# EasyEDA Pro project ran-pang-airlink-86231b34.epro, schematic Schematic1_6, sheets 4 to 9 of 9

## Sheets
4 USB: Page Name: USB; Update Date: 2025-09-05
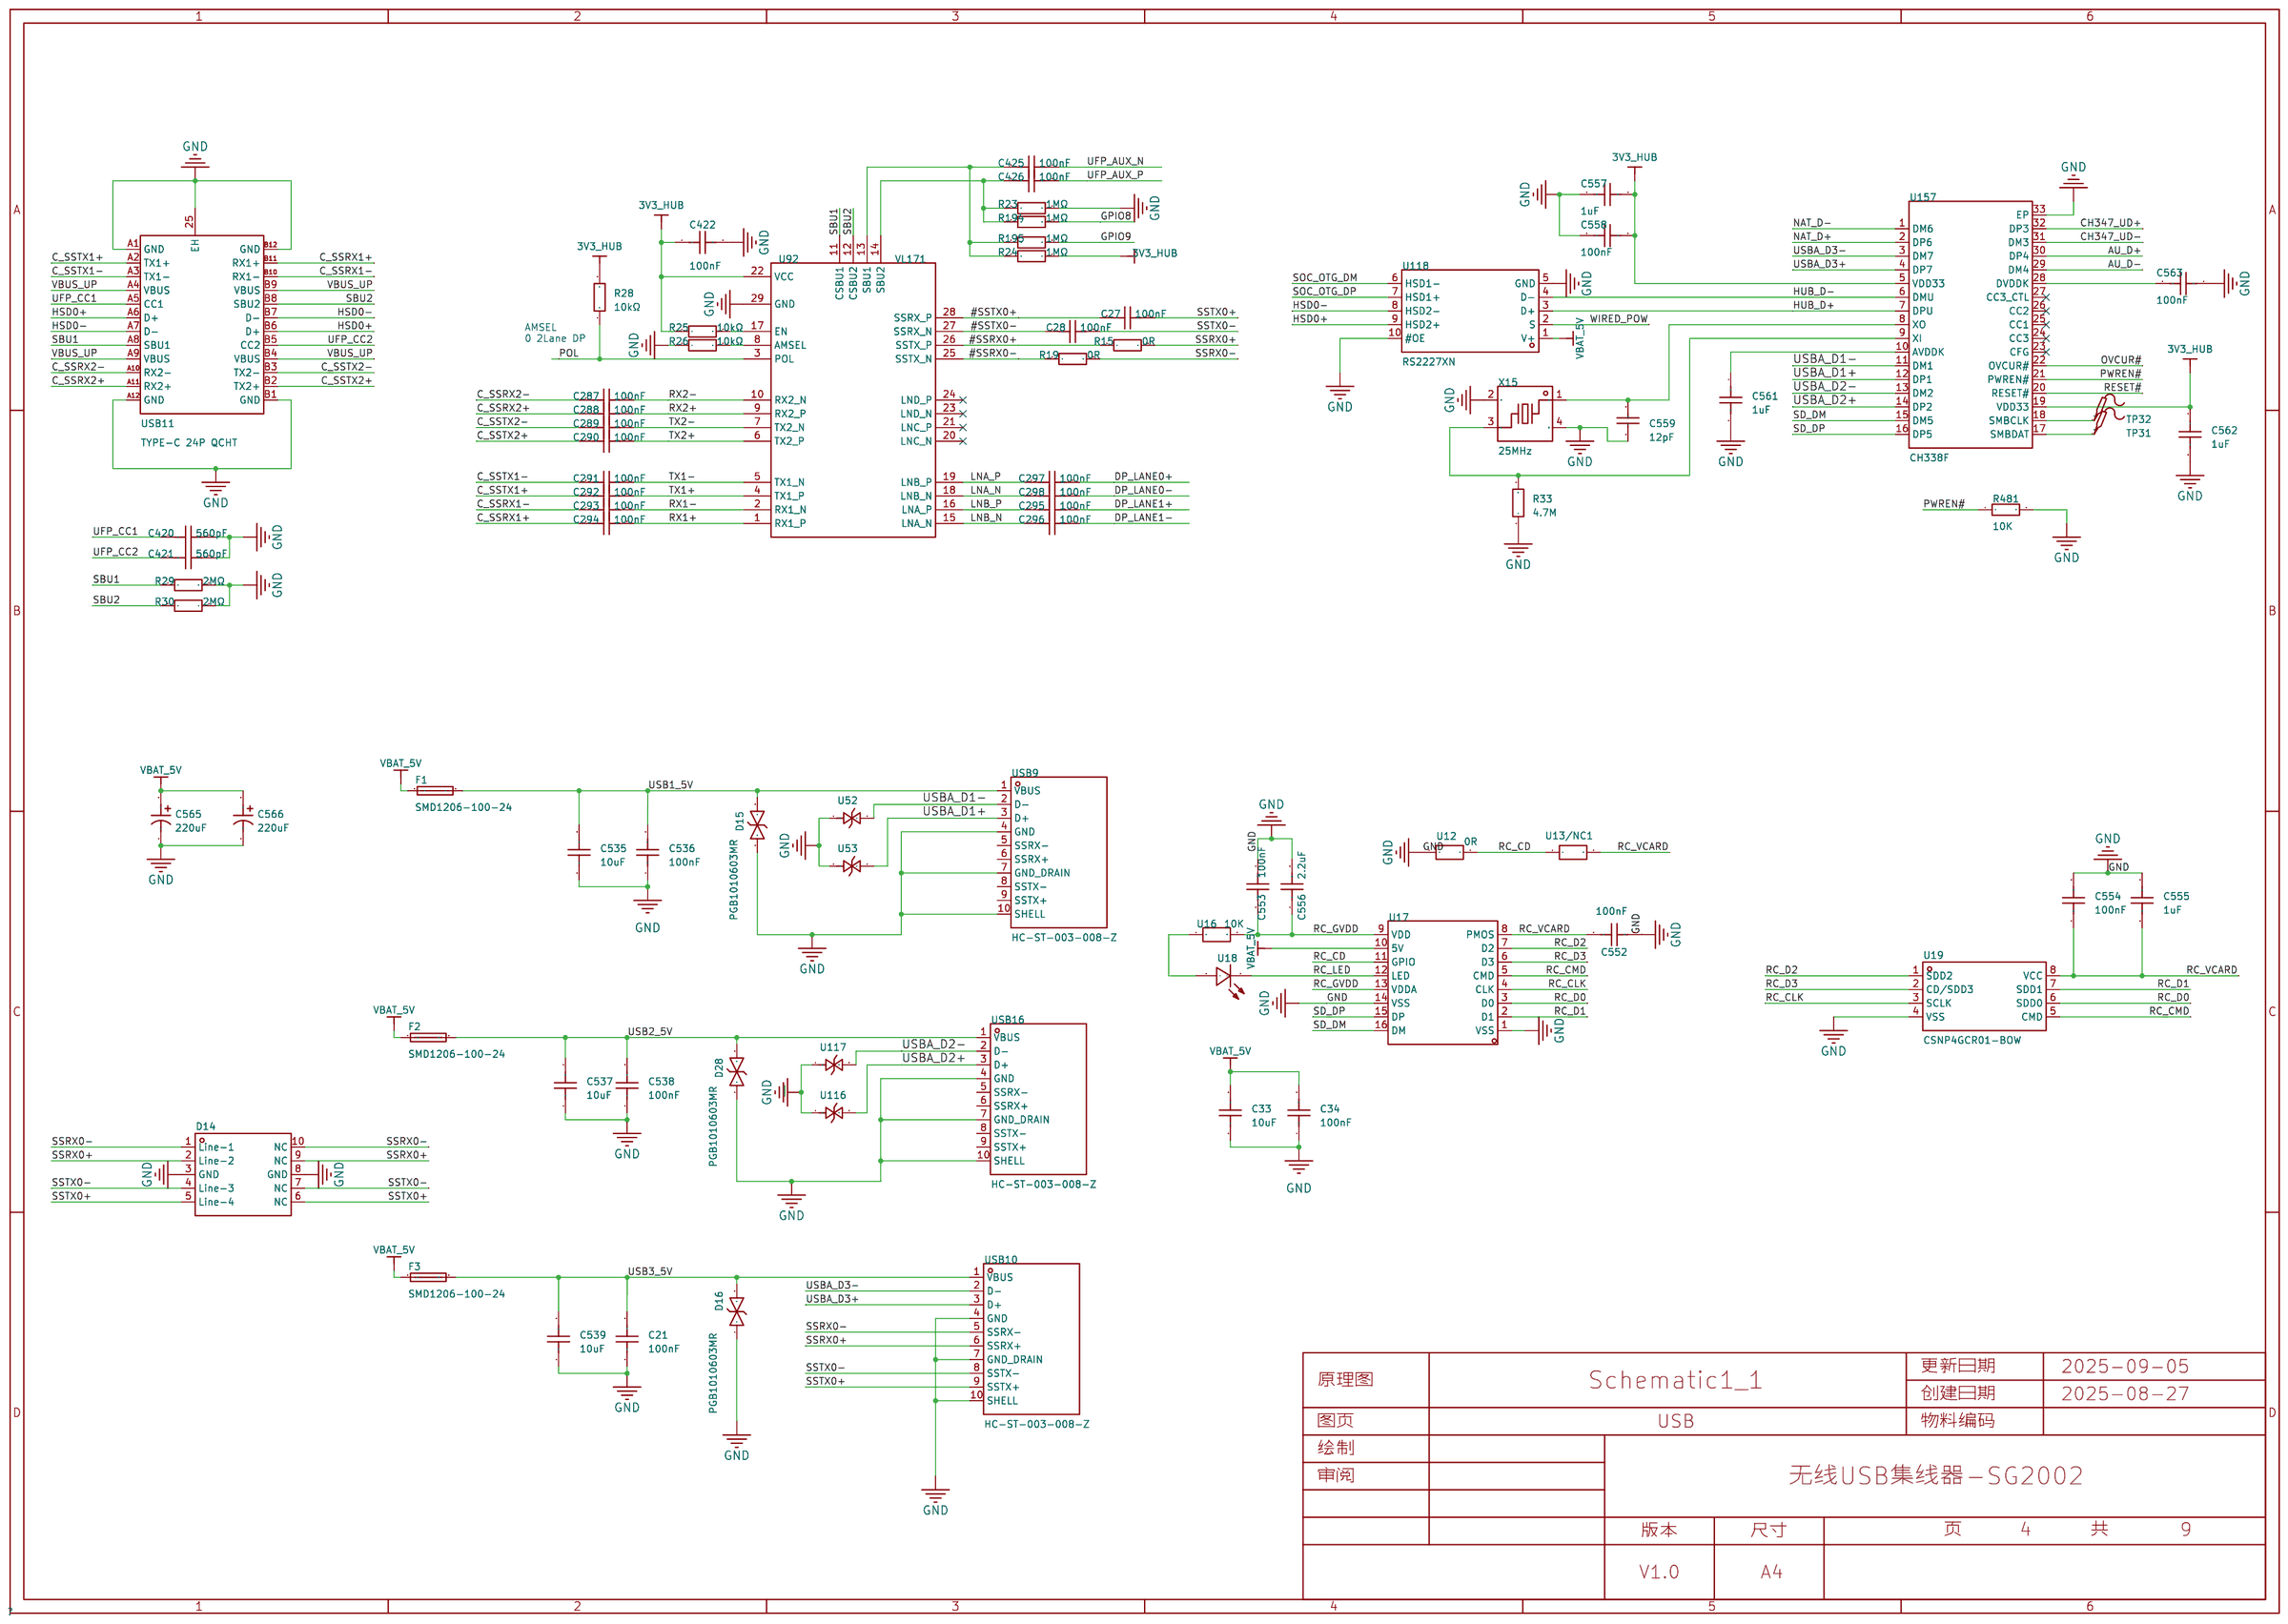
[diagram p3: USB]
5 USB-NAT: Page Name: USB-NAT; Update Date: 2025-08-28
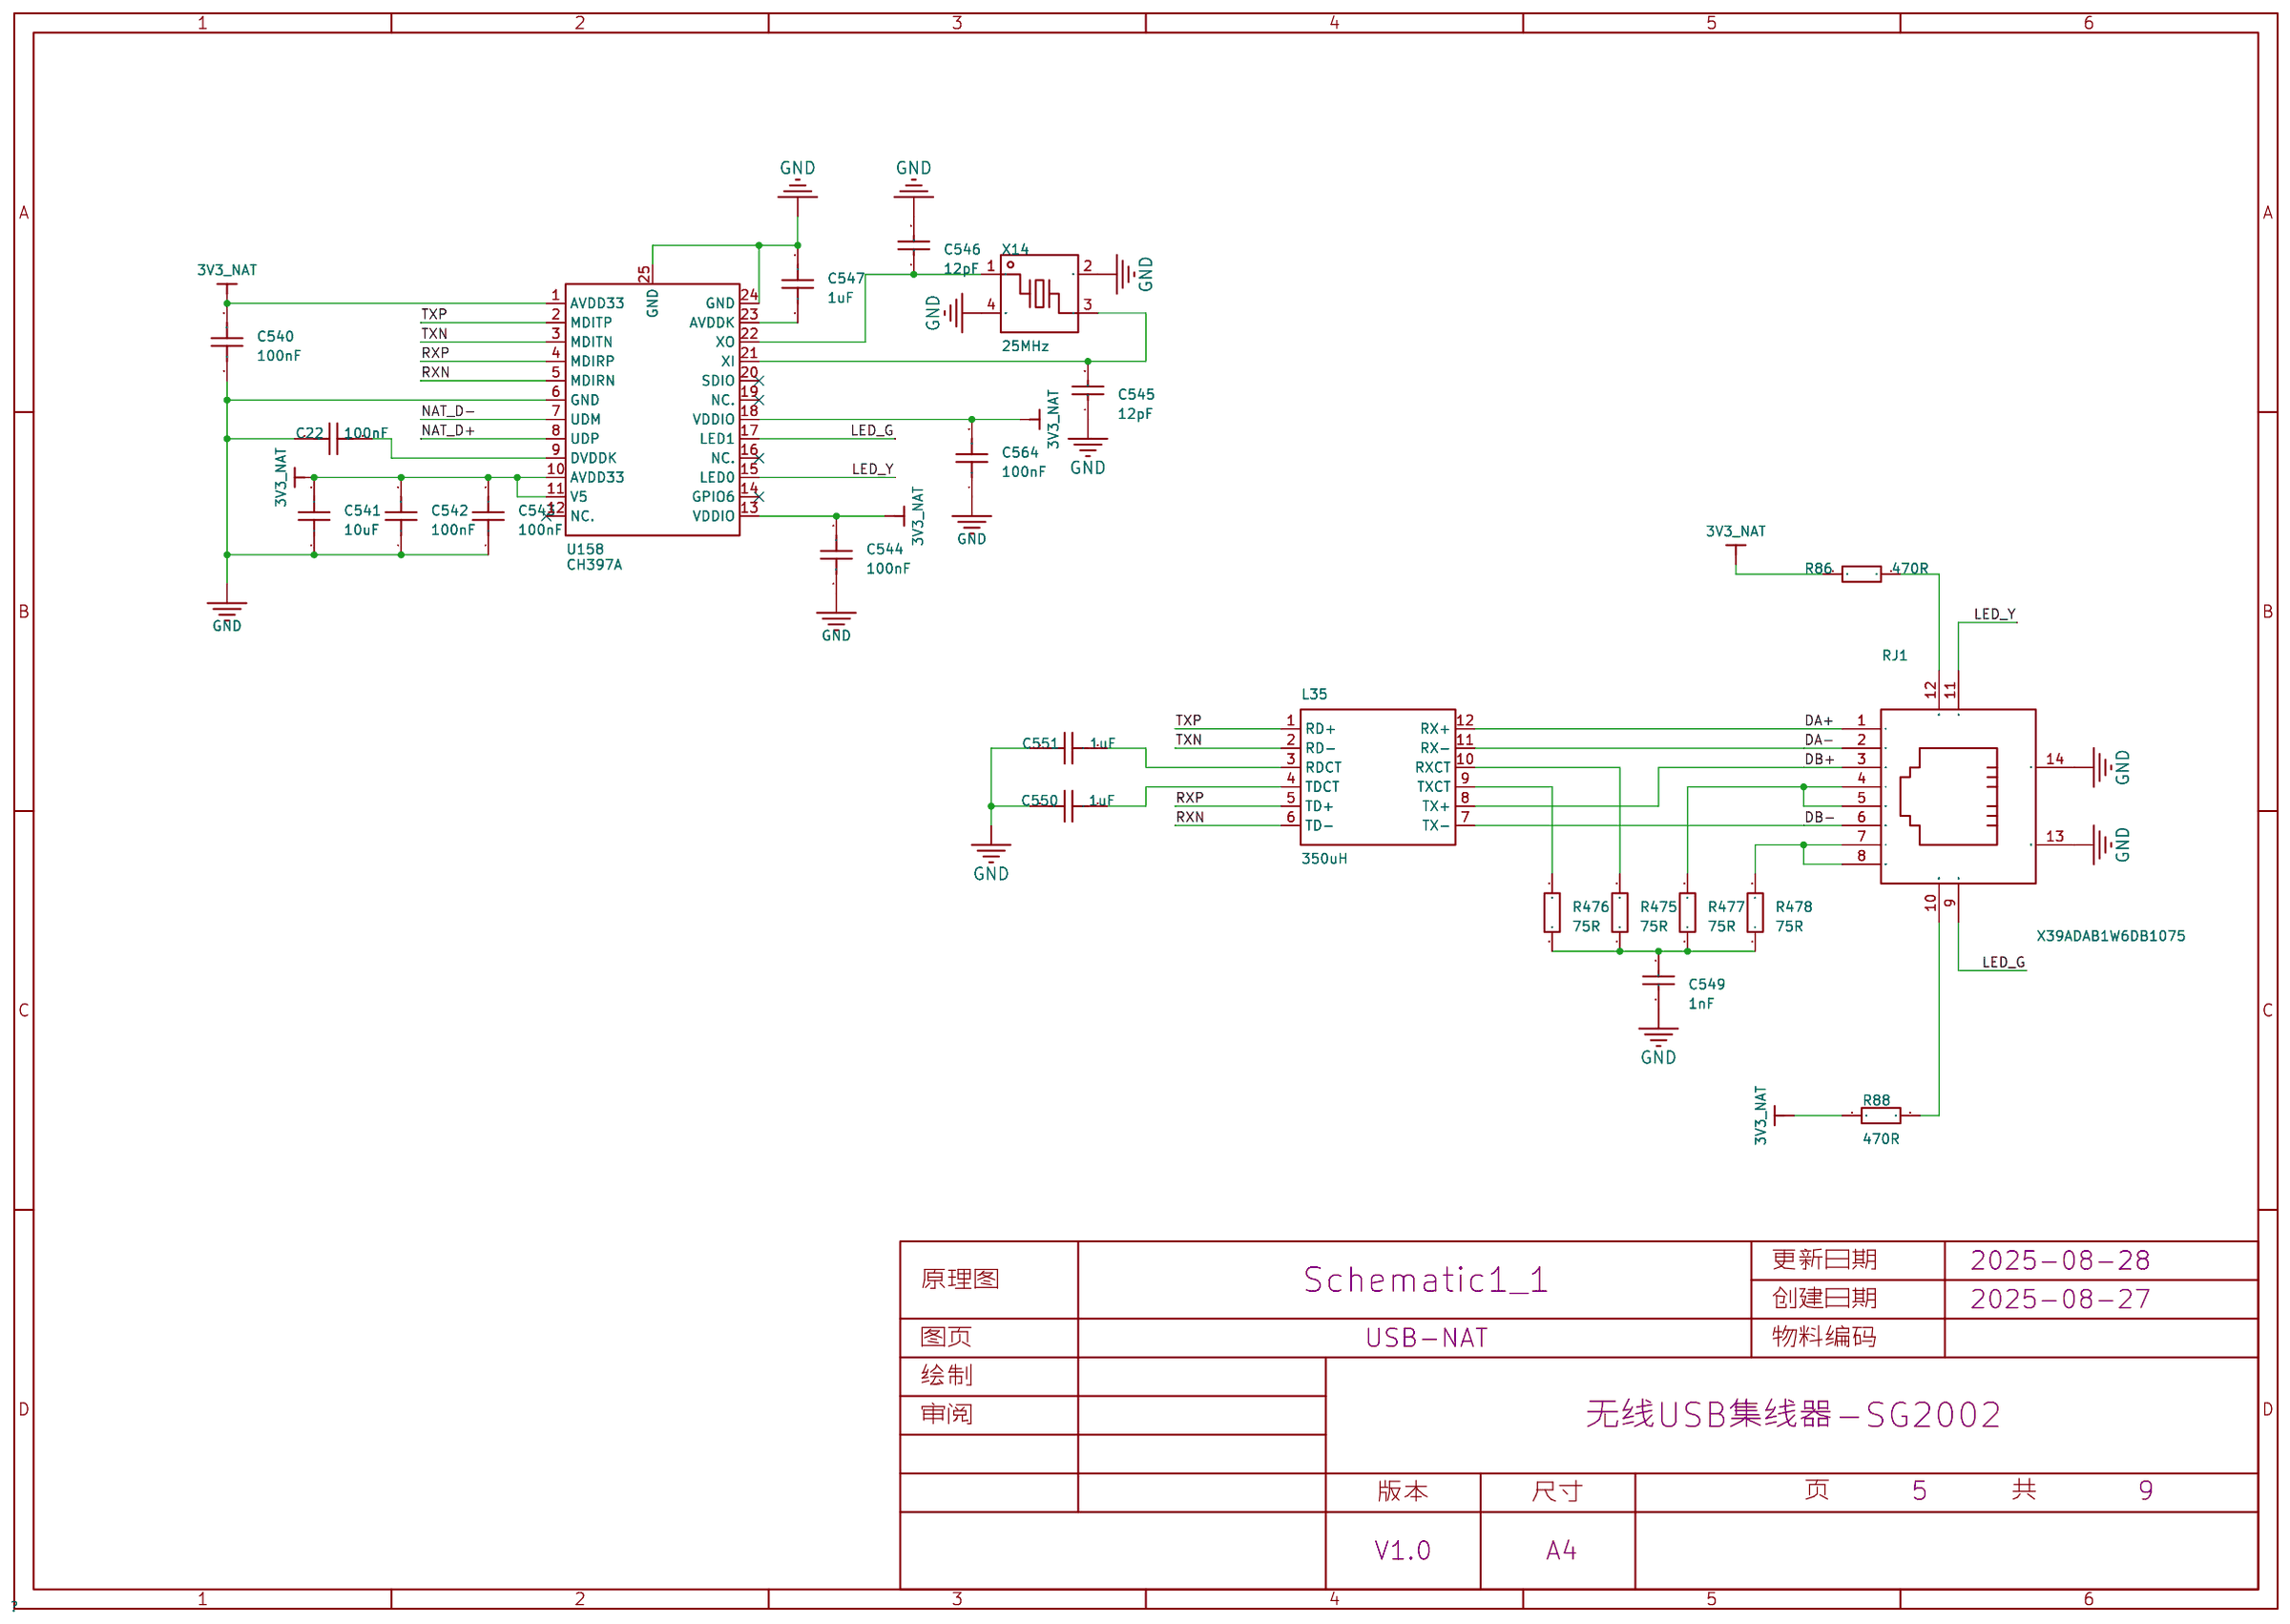
[diagram p4: USB-NAT]
6 DP-HDMI: Page Name: DP-HDMI; Update Date: 2025-08-28
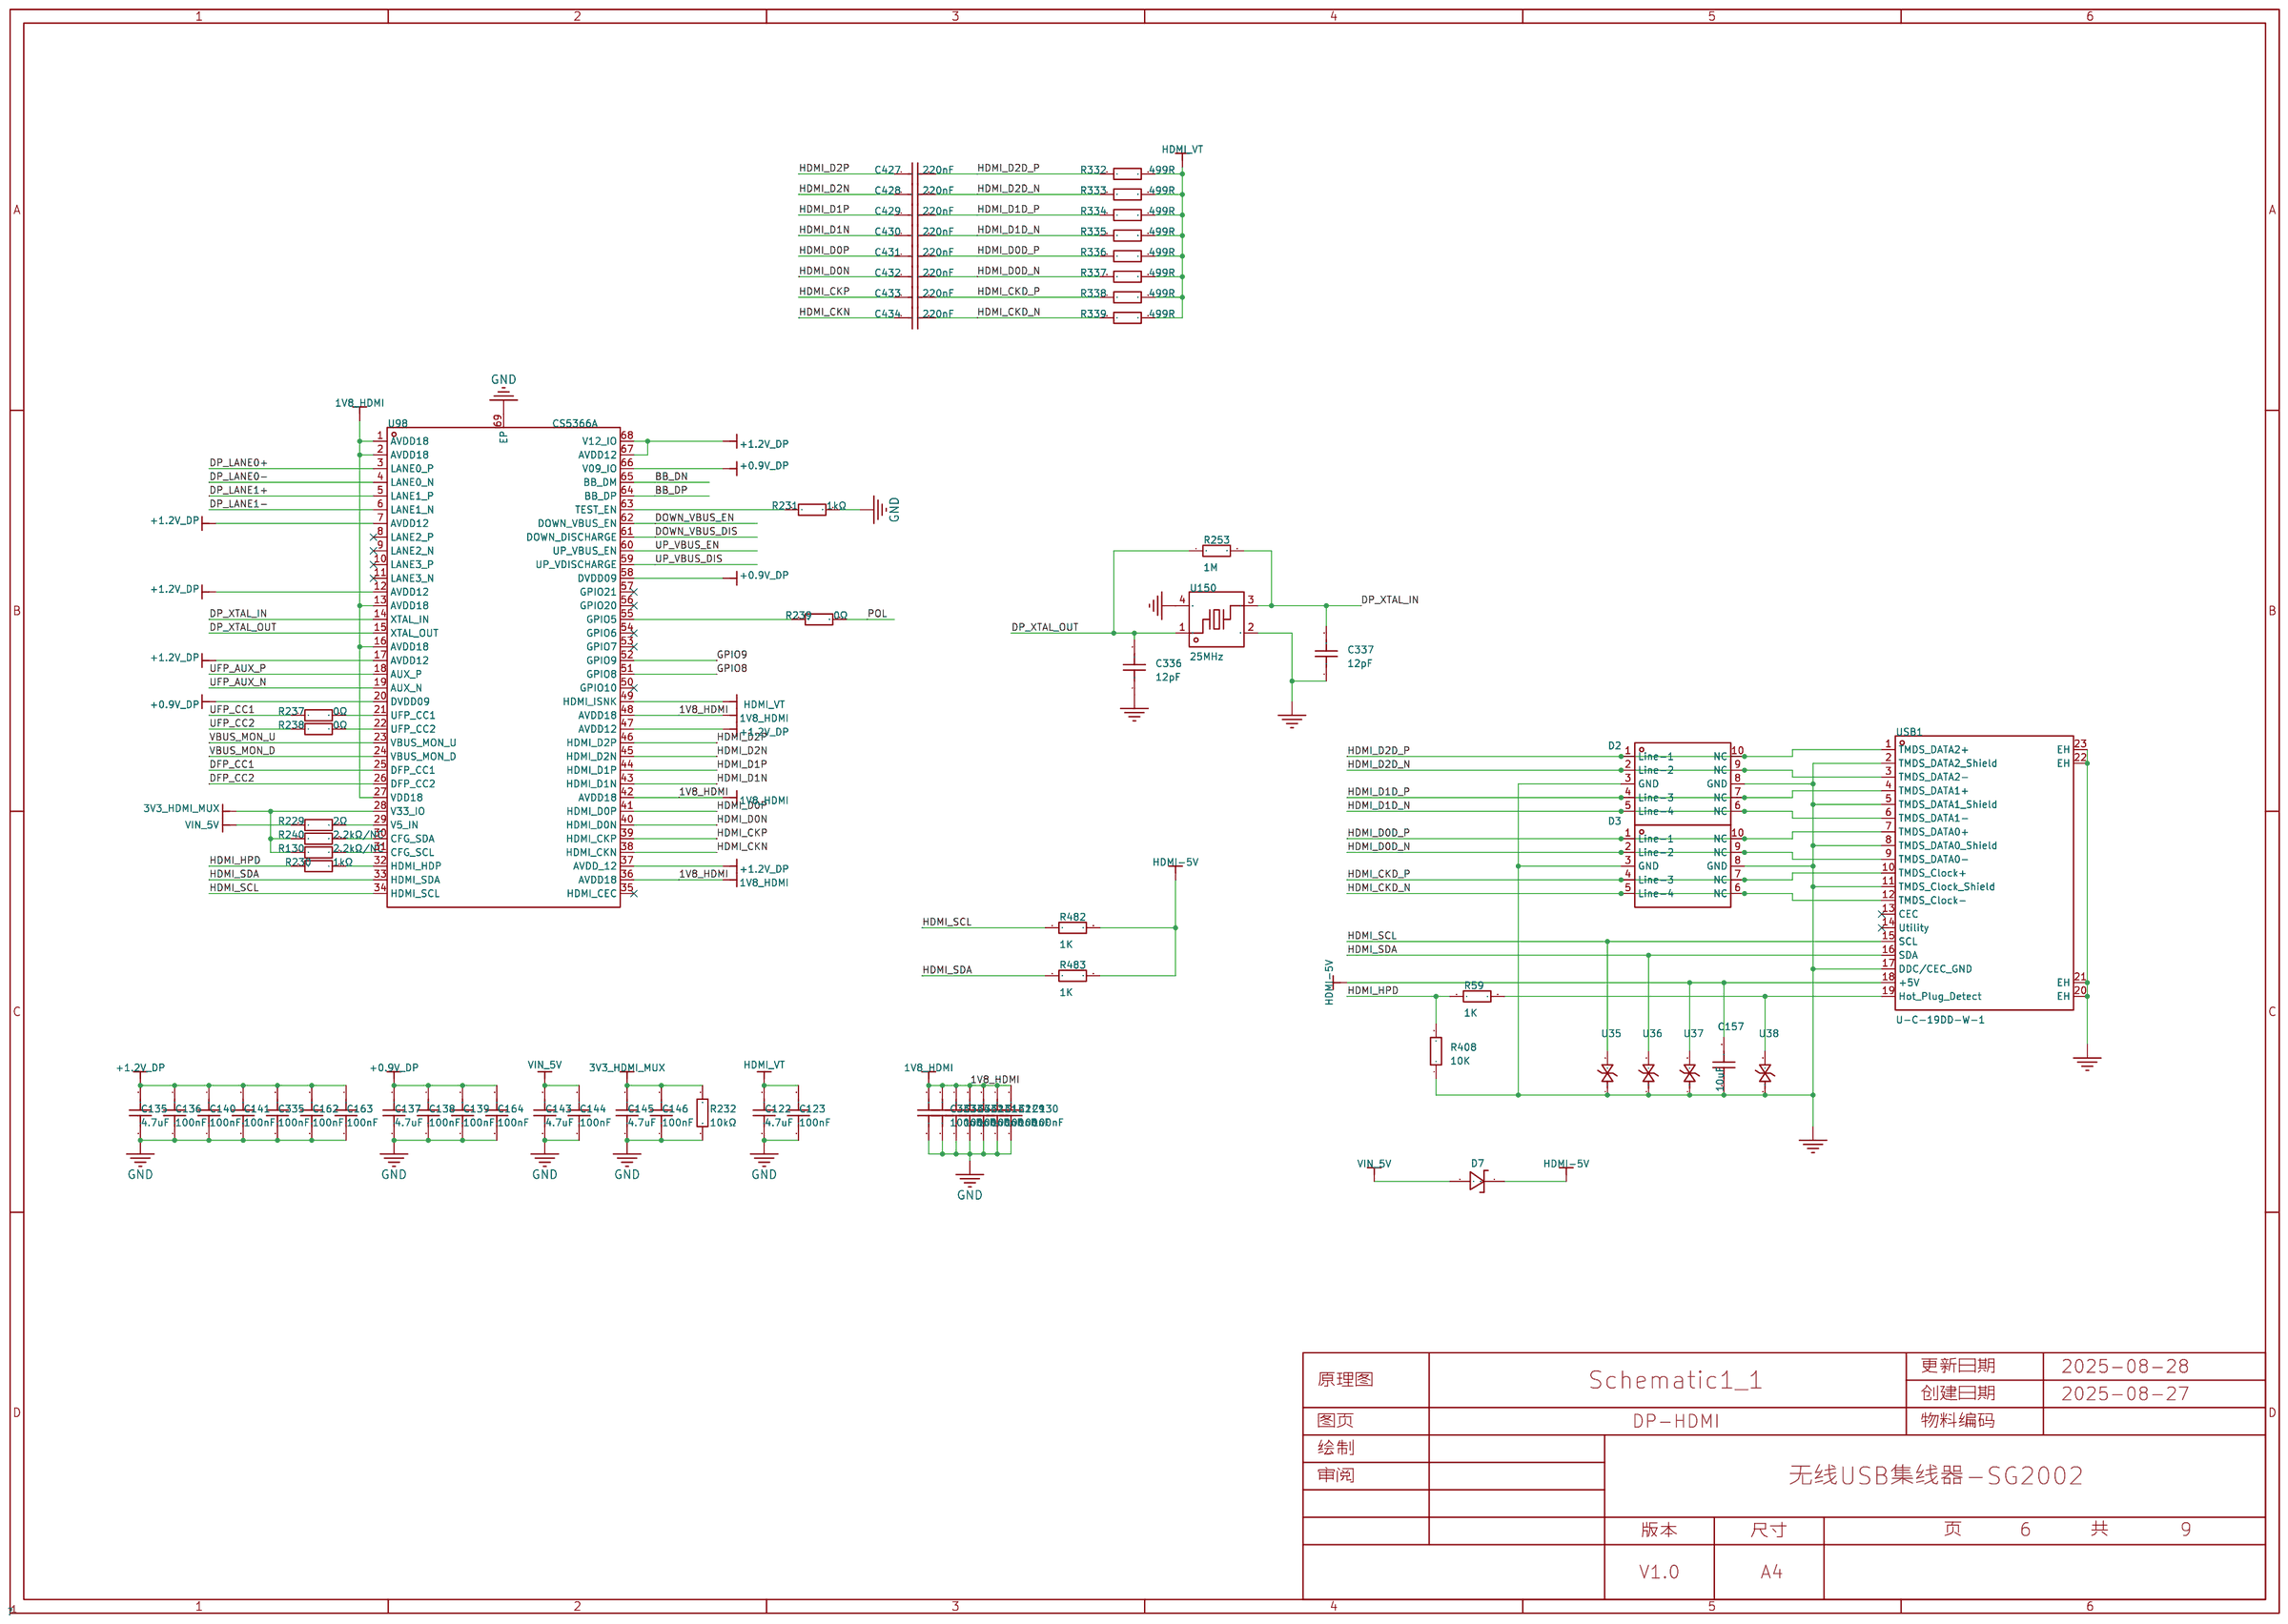
[diagram p5: DP-HDMI]
7 AUDIO: Page Name: AUDIO; Update Date: 2025-09-01
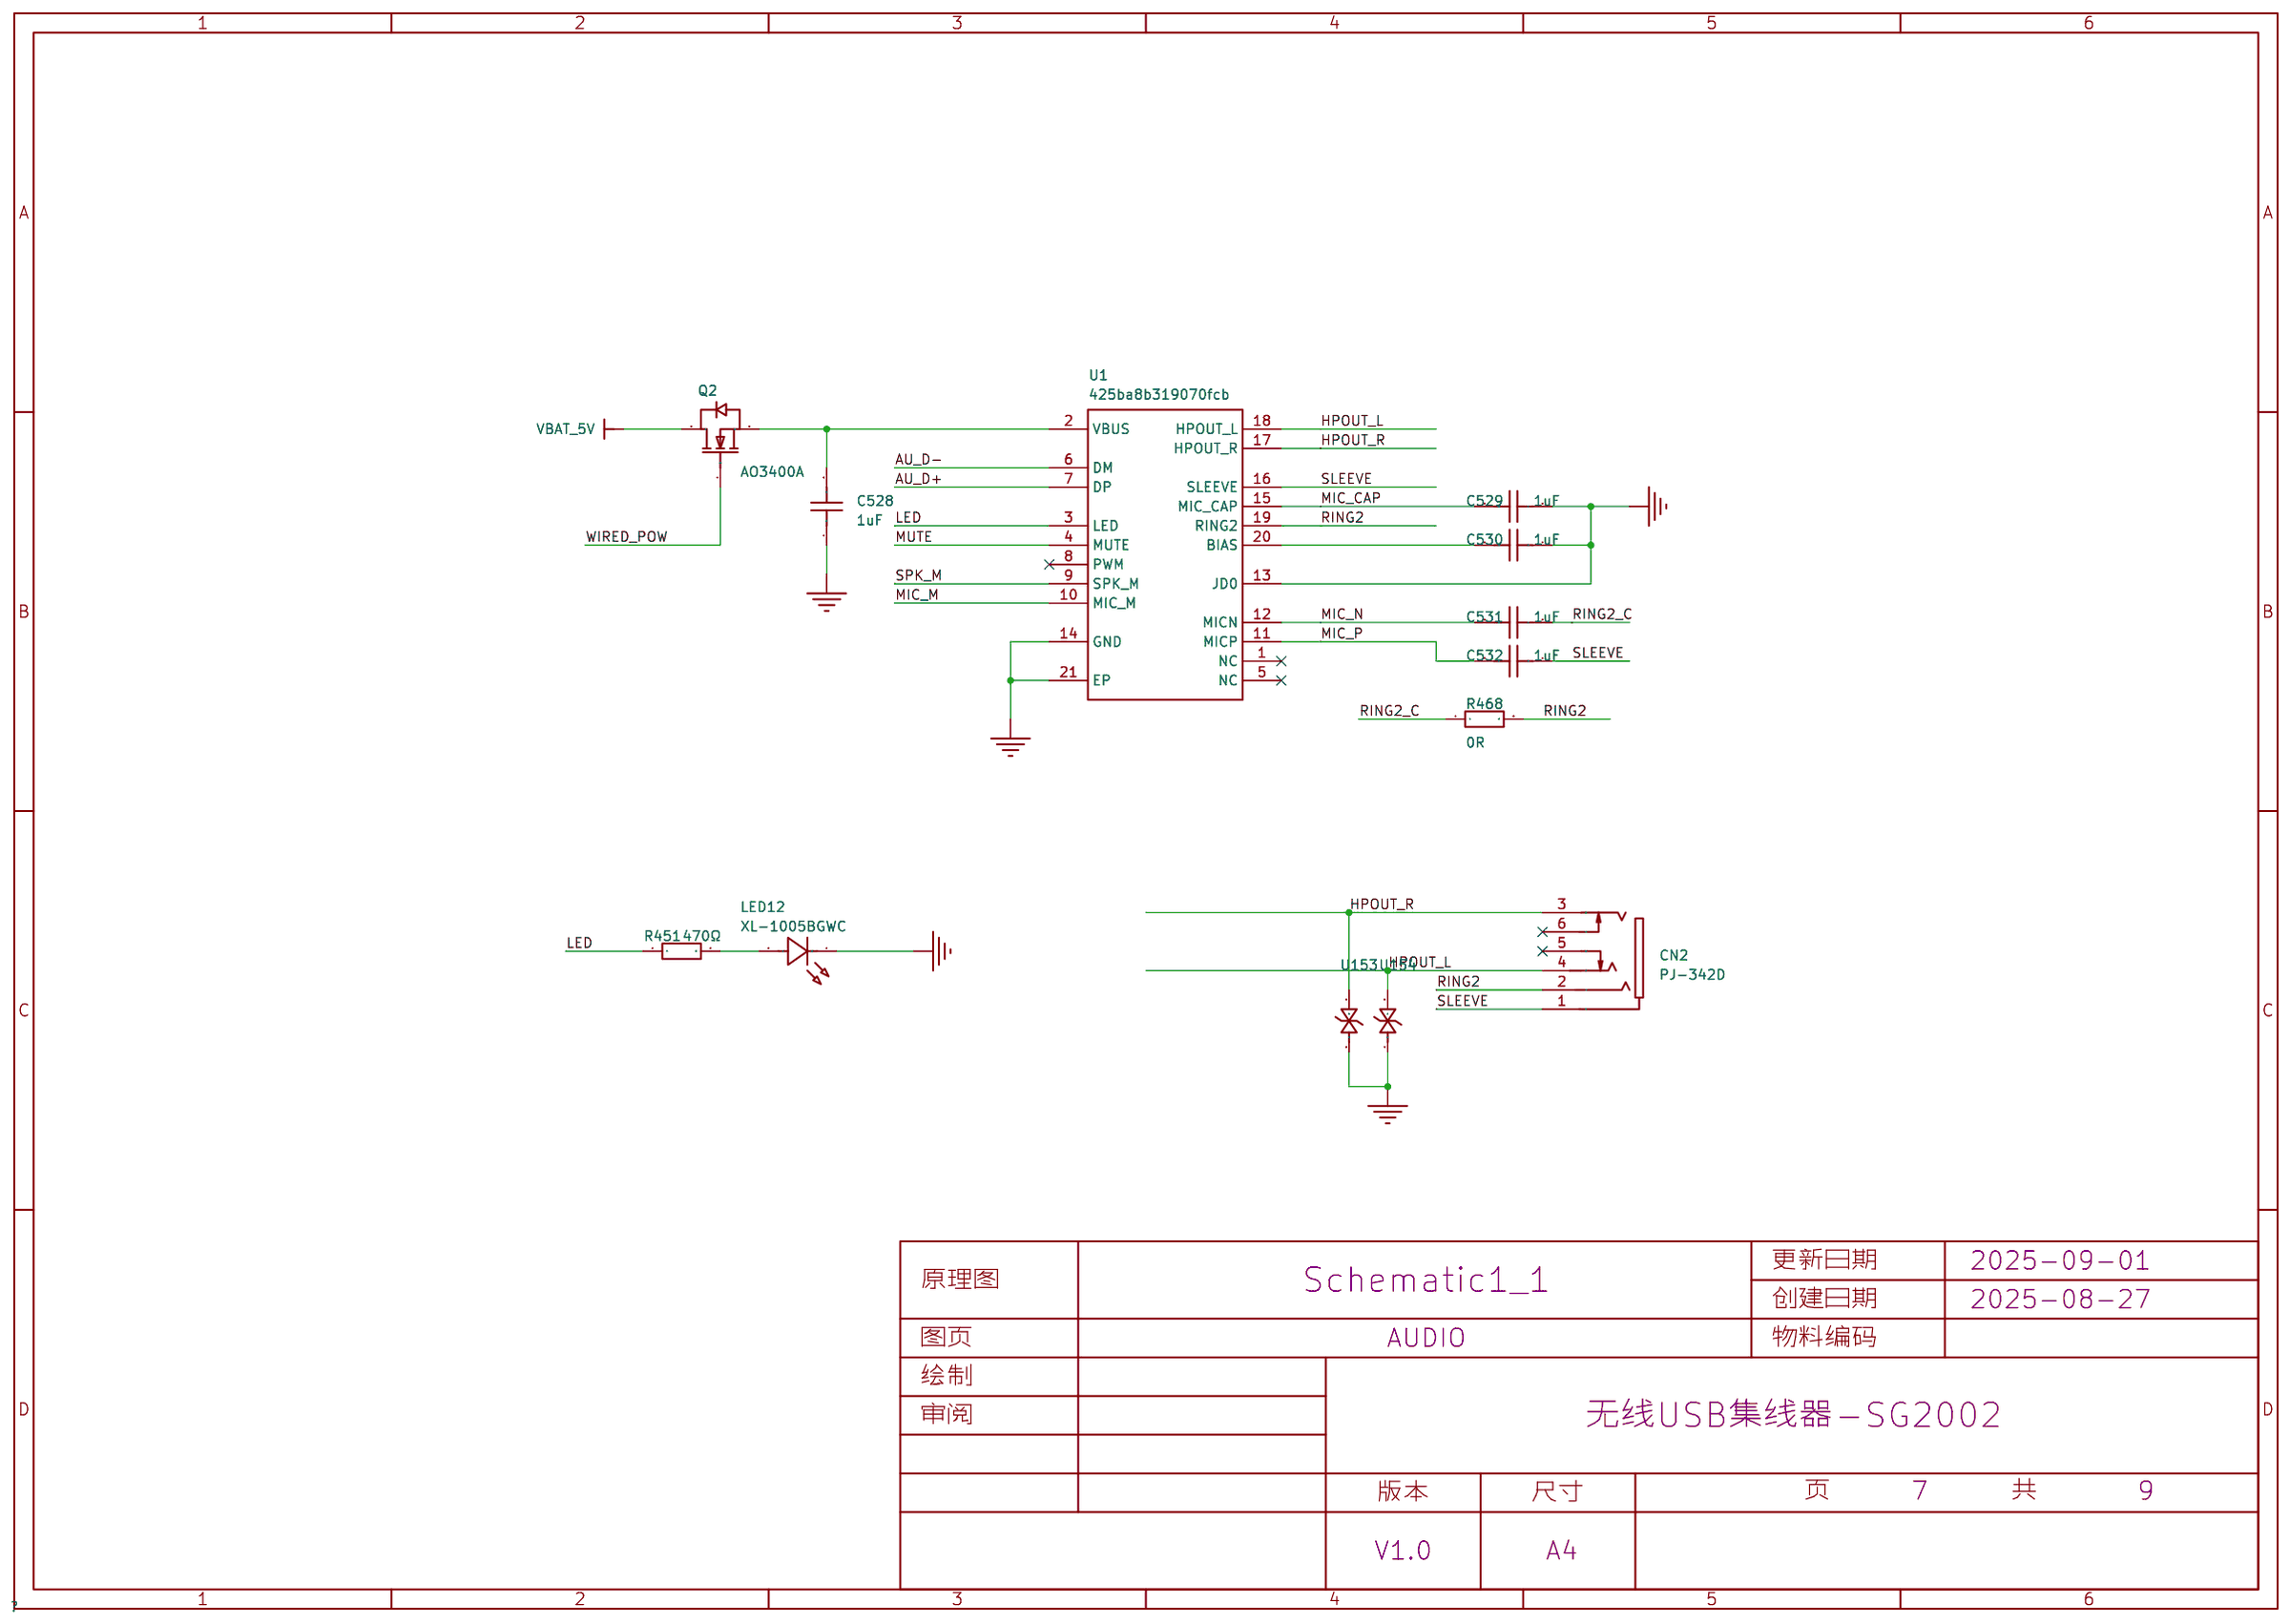
[diagram p6: AUDIO]
8 TFT: Page Name: TFT; Update Date: 2025-09-01
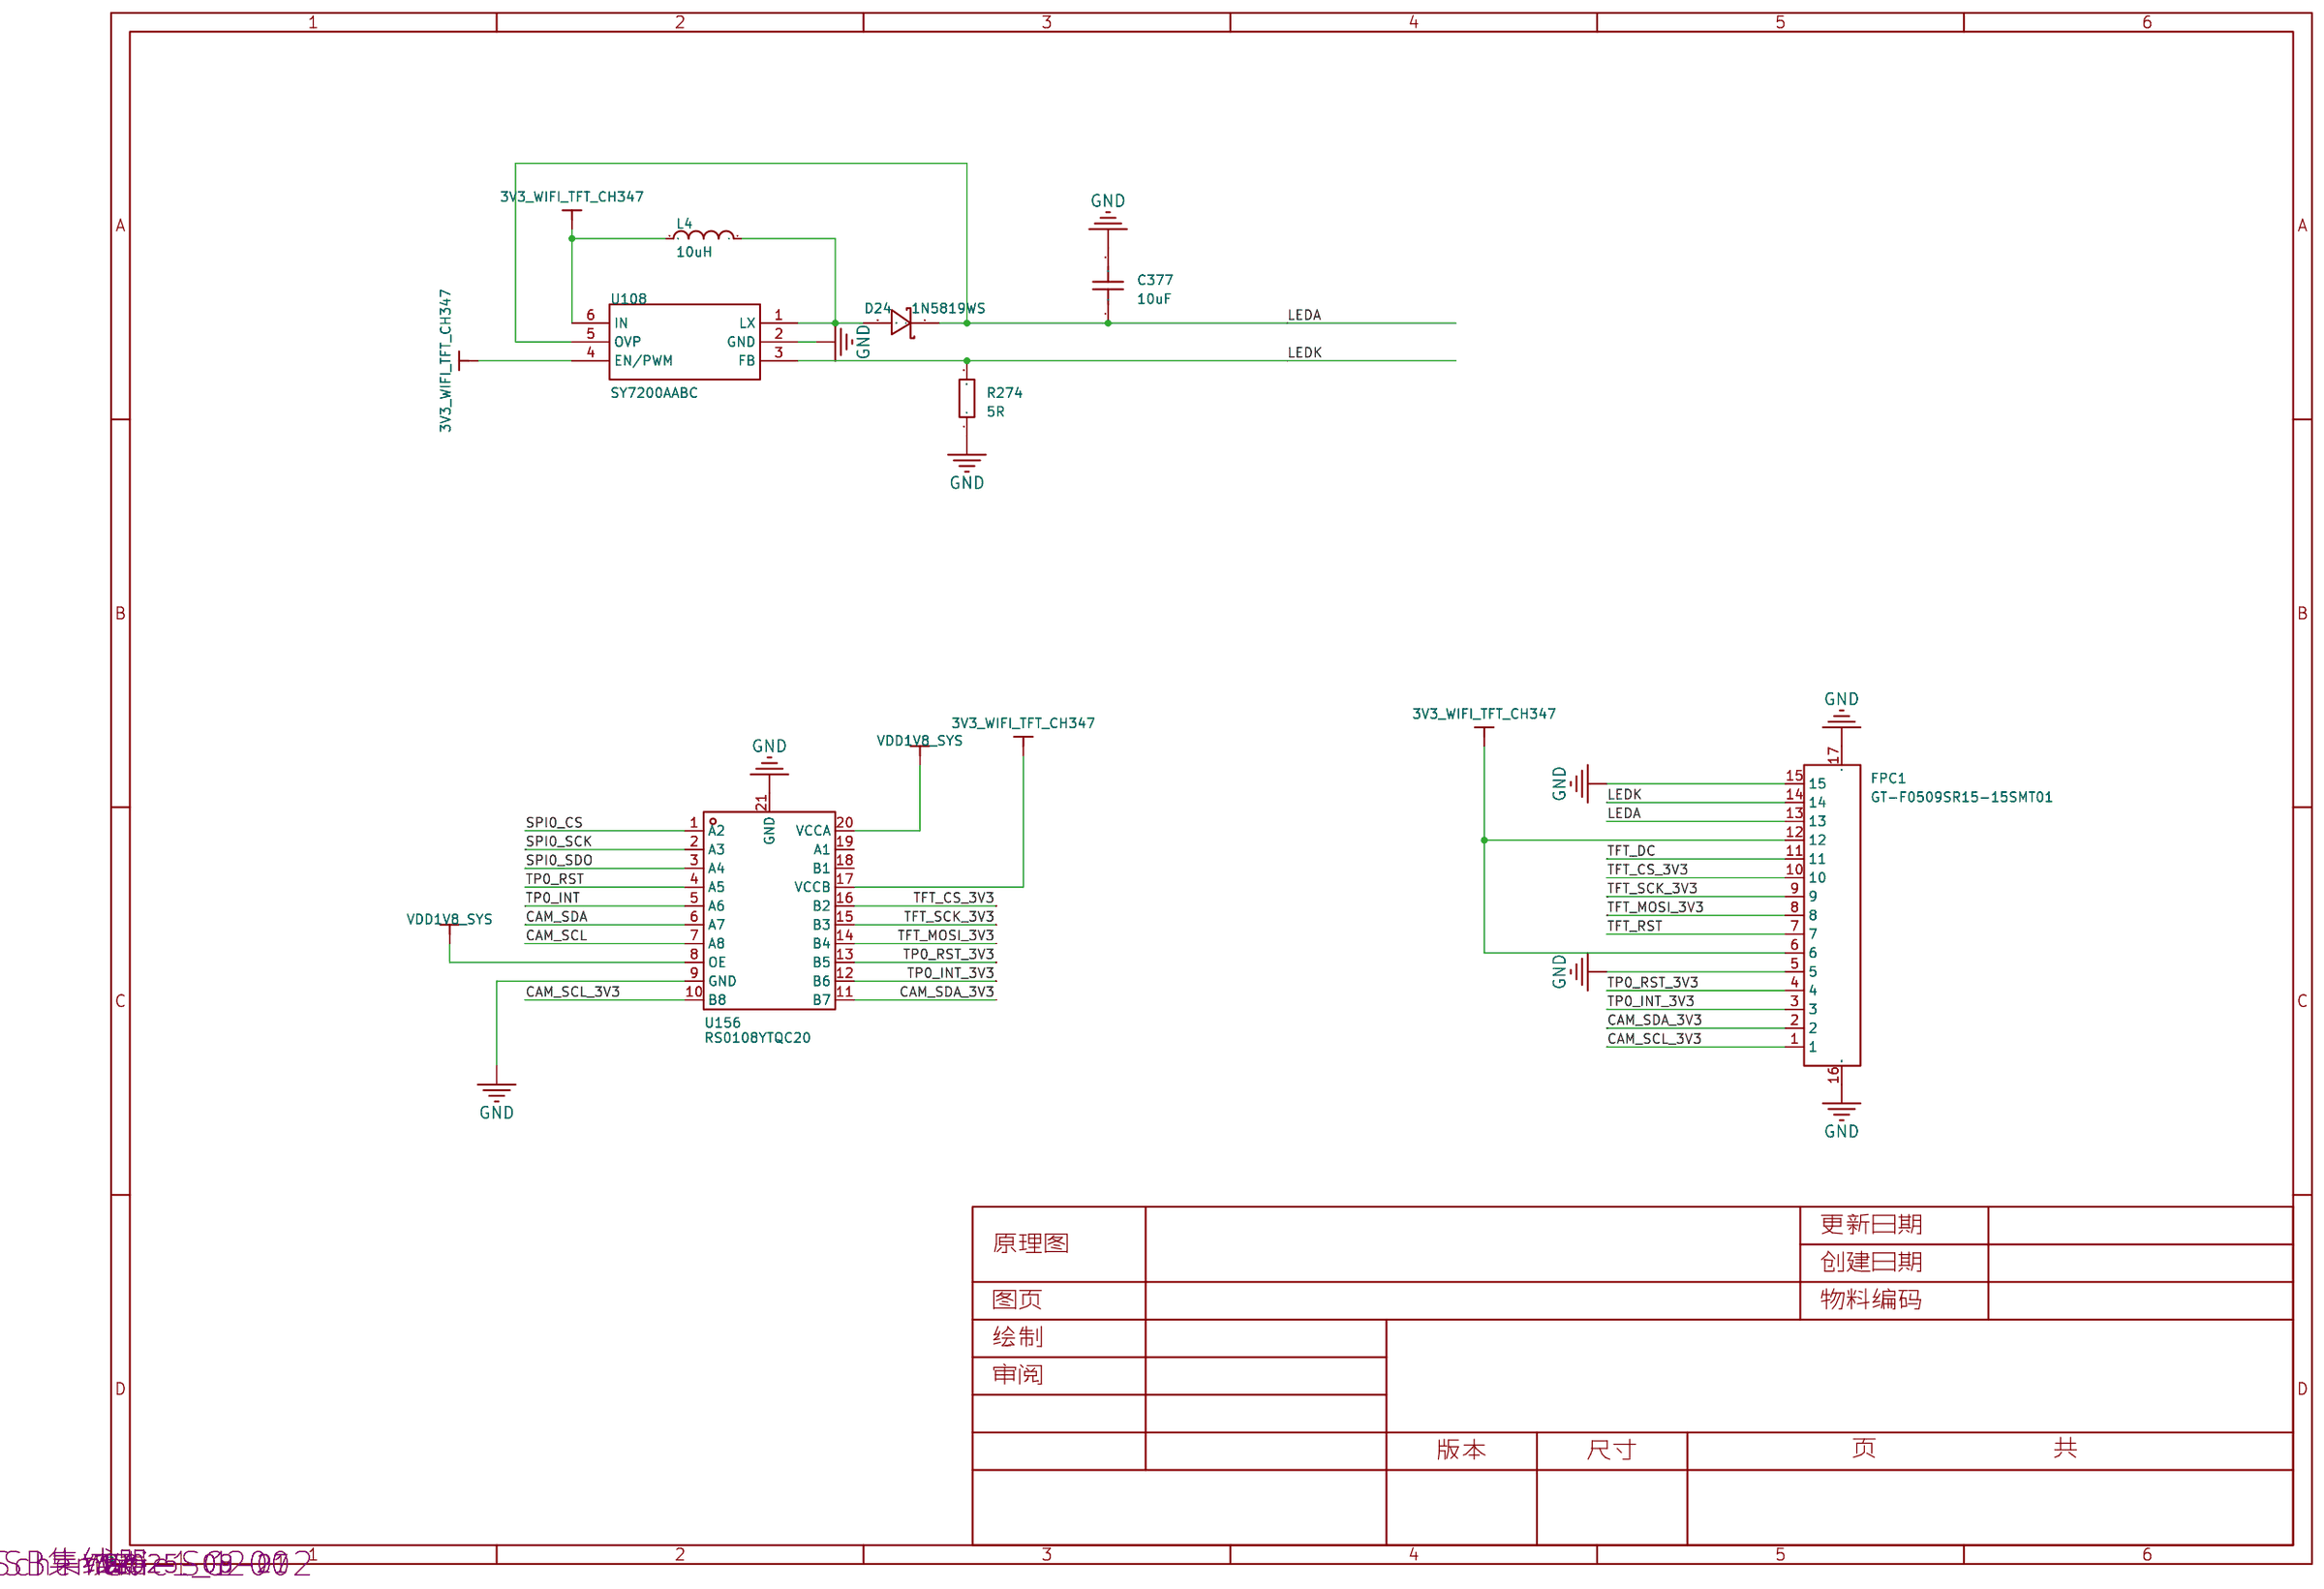
[diagram p7: TFT]
9 CH347: Board Name: Board1; Create Date: 2025-04-15; Page Name: P13; Project Name: 无线USB集线器H618; Schematic Name: Schematic1; Update Date: 2025-04-21
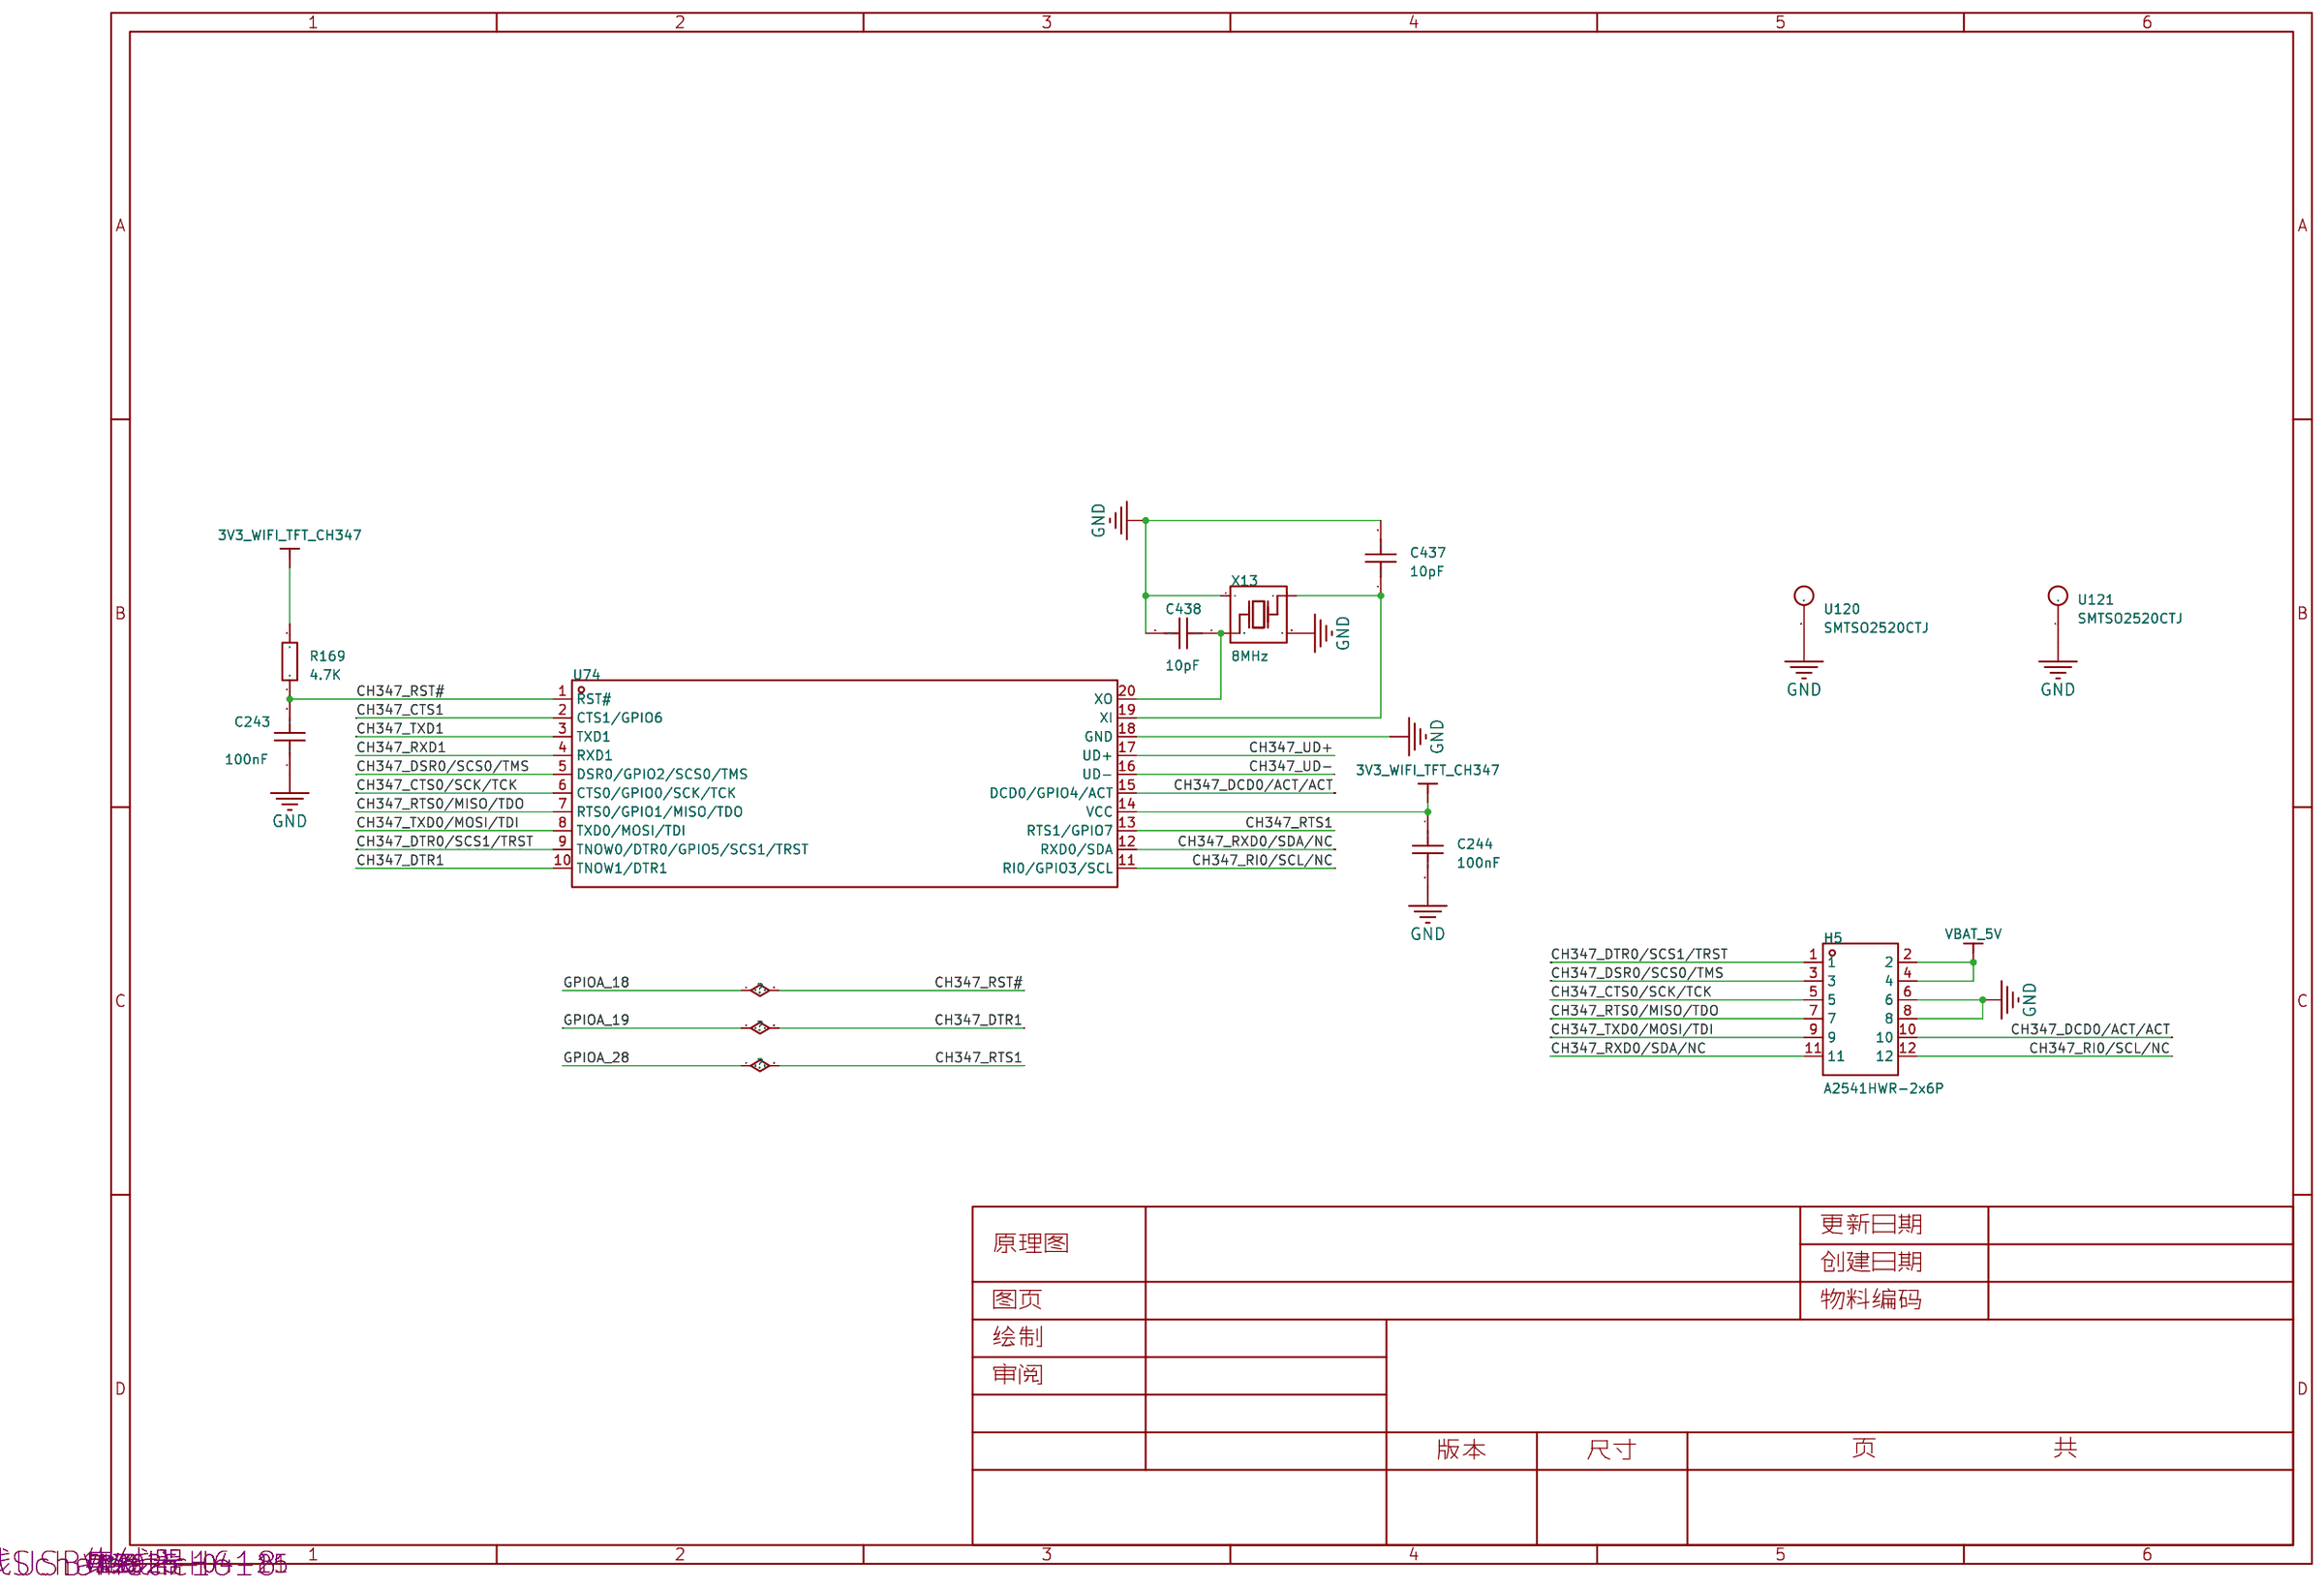
[diagram p8: CH347]

## Parts
sheet AUDIO
C528  1uF  [C0402]
C529  1uF  [C0402]
C530  1uF  [C0402]
C531  1uF  [C0402]
C532  1uF  [C0402]
CN2  PJ-342D  [AUDIO-SMD_PJ-342D]
LED12  XL-1005BGWC  [LED0402]
Q2  AO3400A  [SOT-23-3_L2.9-W1.3-P1.90-LS2.4-BR]
R451  470Ω  [RES0402]
R468  0R  [R0402]
U1  425ba8b319070fcb  [QFN-20_L3.0-W3.0-P0.40-TL-EP1.8]
U153  -  [DFN1006-2L_L1.0-W0.6-P0.70-BI]
U154  -  [DFN1006-2L_L1.0-W0.6-P0.70-BI]
sheet CH347
C243  100nF  [C0402]
C244  100nF  [C0402]
C437  10pF  [C0402]
C438  10pF  [C0402]
H5  A2541HWR-2x6P  [HDR-TH_12P-P2.54-H-F-R2-C6-S2.54-W10.2]
R169  4.7K  [R0402]
U74  CH347T  [TSSOP-20_L6.5-W4.4-P0.65-LS6.4-BL]
U120  SMTSO2520CTJ  [SMD_BD5.6-L5.6-W5.6-D4.1]
U121  SMTSO2520CTJ  [SMD_BD5.6-L5.6-W5.6-D4.1]
X13  8MHz  [CRYSTAL-SMD_4P-L3.2-W2.5-BL]
sheet DP-HDMI
C122  4.7uF  [R0402]
C123  100nF  [R0402]
C129  100nF  [R0402]
C130  100nF  [R0402]
C131  100nF  [R0402]
C132  100nF  [R0402]
C135  4.7uF  [R0402]
C136  100nF  [R0402]
C137  4.7uF  [R0402]
C138  100nF  [R0402]
C139  100nF  [R0402]
C140  100nF  [R0402]
C141  100nF  [R0402]
C143  4.7uF  [R0402]
C144  100nF  [R0402]
C145  4.7uF  [R0402]
C146  100nF  [R0402]
C157  10uF  [C0402]
C162  100nF  [R0402]
C163  100nF  [R0402]
C164  100nF  [R0402]
C332  100nF  [R0402]
C333  100nF  [R0402]
C334  100nF  [R0402]
C335  100nF  [R0402]
C336  12pF  [C0402]
C337  12pF  [C0402]
C427  220nF  [C0201]
C428  220nF  [C0201]
C429  220nF  [C0201]
C430  220nF  [C0201]
C431  220nF  [C0201]
C432  220nF  [C0201]
C433  220nF  [C0201]
C434  220nF  [C0201]
D2  AZ1045-04F.R7G  [DFN2510-10_L2.5-W1.0-P0.50-BL]
D3  AZ1045-04F.R7G  [DFN2510-10_L2.5-W1.0-P0.50-BL]
D7  1N5819WS  [SOD-323_L1.8-W1.3-LS2.5-RD]
R59  1K  [R0402]
R130  2.2kΩ/NC  [R0402]  (no BOM)
R229  2Ω  [R0603]
R230  1kΩ  [R0402]
R231  1kΩ  [R0402]
R232  10kΩ  [R0402]
R237  0Ω  [R0402]
R238  0Ω  [R0402]
R239  0Ω  [R0402]
R240  2.2kΩ/NC  [R0402]  (no BOM)
R253  1M  [R0402]
R332  499R  [R0201]
R333  499R  [R0201]
R334  499R  [R0201]
R335  499R  [R0201]
R336  499R  [R0201]
R337  499R  [R0201]
R338  499R  [R0201]
R339  499R  [R0201]
R408  10K  [R0402]
R482  1K  [R0402]
R483  1K  [R0402]
U35  -  [DFN1006-2L_L1.0-W0.6-P0.70-BI]
U36  -  [DFN1006-2L_L1.0-W0.6-P0.70-BI]
U37  -  [DFN1006-2L_L1.0-W0.6-P0.70-BI]
U38  -  [DFN1006-2L_L1.0-W0.6-P0.70-BI]
U98  CS5366A  [QFN-68_L8.0-W8.0-P0.40-TL-EP5.7]
U150  25MHz  [CRYSTAL-SMD_4P-L2.0-W1.6-BL]
USB1  U-C-19DD-W-1  [HDMI-SMD_U-C-19DD-W-1]
sheet TFT
C377  10uF  [C0402]
D24  1N5819WS  [SOD-323_L1.8-W1.3-LS2.5-RD]
FPC1  GT-F0509SR15-15SMT01  [CONN-SMD_GT-F0509SR15-15SMT01]
L4  10uH  [IND-SMD_L2.5-W2.0]
R274  5R  [R0402]
U108  SY7200AABC  [SOT-23-6_L2.9-W1.6-P0.95-LS2.8-BR]
U156  RS0108YTQC20  [QFN-20_L3.0-W3.0-P0.40-BL-EP1.7]
sheet USB-NAT
C22  100nF  [C0402]
C540  100nF  [C0402]
C541  10uF  [C0402]
C542  100nF  [C0402]
C543  100nF  [C0402]
C544  100nF  [C0402]
C545  12pF  [R0402]
C546  12pF  [R0402]
C547  1uF  [C0402]
C549  1nF  [C1206]
C550  1uF  [C0603_1]
C551  1uF  [C0603_1]
C564  100nF  [C0402]
L35  350uH  [XFMR-SMD_12P-P1.27_HX0068ANLTP]
R86  470R  [R0402]
R88  470R  [R0402]
R475  75R  [R0603]
R476  75R  [R0603]
R477  75R  [R0603]
R478  75R  [R0603]
RJ1  X39ADAB1W6DB1075  [RJ45-TH_XKB_X39ADAB1W6DB1075]
U158  CH397A  [QFN-24_L4.0-W4.0-P0.50-BL-EP2.8]
X14  25MHz  [CRYSTAL-SMD_4P-L2.0-W1.6-BL]
sheet USB
C21  100nF  [C0402]
C27  100nF  [R0402]
C28  100nF  [R0402]
C33  10uF  [C0402]
C34  100nF  [C0402]
C287  100nF  [R0402]
C288  100nF  [R0402]
C289  100nF  [R0402]
C290  100nF  [R0402]
C291  100nF  [R0402]
C292  100nF  [R0402]
C293  100nF  [R0402]
C294  100nF  [R0402]
C295  100nF  [R0402]
C296  100nF  [R0402]
C297  100nF  [R0402]
C298  100nF  [R0402]
C420  560pF  [C0402]
C421  560pF  [C0402]
C422  100nF  [C0402]
C425  100nF  [R0402]
C426  100nF  [R0402]
C535  10uF  [C0402]
C536  100nF  [C0402]
C537  10uF  [C0402]
C538  100nF  [C0402]
C539  10uF  [C0402]
C552  100nF  [C0402_1]
C553  100nF  [C0402_1]
C554  100nF  [C0402_1]
C555  100nF  [C0402_1]
C556  2.2uF  [C0402_1]
C557  1uF  [R0402]
C558  100nF  [R0402]
C559  12pF  [R0402]
C561  1uF  [R0402]
C562  1uF  [R0402]
C563  100nF  [R0402]
C565  220uF  [CAP-SMD_L7.3-W4.3-RD_177EC0013]
C566  220uF  [CAP-SMD_L7.3-W4.3-RD_177EC0013]
D14  AZ1045-04F.R7G  [DFN2510-10_L2.5-W1.0-P0.50-BL]
D15  PGB1010603MR  [D0603-BI]
D16  PGB1010603MR  [D0603-BI]
D28  PGB1010603MR  [D0603-BI]
F1  SMD1206-100-24  [F1206]
F2  SMD1206-100-24  [F1206]
F3  SMD1206-100-24  [F1206]
R15  0R  [R0402]
R19  0R  [R0402]
R23  1MΩ  [R0402]  (no BOM)
R24  1MΩ  [R0402]  (no BOM)
R25  10kΩ  [R0402]
R26  10kΩ  [R0402]
R28  10kΩ  [R0402]
R29  2MΩ  [R0402]
R30  2MΩ  [R0402]
R33  4.7M  [R0402]
R194  1MΩ  [R0402]
R195  1MΩ  [R0402]
R481  10K  [R0402]
TP31  -  [Test-Point-0.5mm]
TP32  -  [Test-Point-0.5mm]
U12  0R  [R0402_1]
U13/NC1  10K  [R0402_1]
U16  10K  [R0402_1]
U17  GL823K  [SSOP-16_L4.9-W3.9-P0.64-LS6.0-BL]
U18  SML-LX0603SRW-TR  [LED0603-RD_RED]
U19  CSNP4GCR01-BOW  [LGA-8_L6.0-W8.0-P1.27-TL]
U52  -  [DFN1006-2L_L1.0-W0.6-P0.70-BI]
U53  -  [DFN1006-2L_L1.0-W0.6-P0.70-BI]
U92  VL171  [VL170]
U116  -  [DFN1006-2L_L1.0-W0.6-P0.70-BI]
U117  -  [DFN1006-2L_L1.0-W0.6-P0.70-BI]
U118  RS2227XN  [MSOP-10_L3.0-W3.0-P0.50-LS5.0-BL]
U157  CH338F  [QFN-32_L4.0-W4.0-P0.40-TL-EP2.7]
USB9  HC-ST-003-008-Z  [USB-3.0-A-SMD_ST-003-008-J]
USB10  HC-ST-003-008-Z  [USB-3.0-A-SMD_ST-003-008-J]
USB11  TYPE-C 24P QCHT  [TYPE-C-SMD_TYPE-C-24P-QCHT]
USB16  HC-ST-003-008-Z  [USB-3.0-A-SMD_ST-003-008-J]
X15  25MHz  [CRYSTAL-SMD_4P-L2.0-W1.6-BL]

## Library data of the parts
C21 C22 C27 C28 C33 C34 C157 C243 C244 C336 C337 C420-C422 C437 C438 C528-C532 C535-C544 C547 C564 = CAP_0402: Supplier Footprint: 0402
CN2 = PJ-342D: 连接器类型:3.5mm耳机座;额定电流:500mA;额定电压:30V;工作温度范围:-20℃~+70℃;焊接温度(最大值):235℃;; LCSC Part Name: 3.5mm耳机座; Supplier Part: C2689707; Manufacturer: XKB Connectivity(中国星坤); Supplier Footprint: SMD; JLCPCB Part Class: Extended Part; Datasheet: https://atta.szlcsc.com/upload/public/pdf/source/20211011/5410BBAF7F4CEA04F8E2A1AE1B358EC2.pdf; Supplier: LCSC; Connector Type: 3.5mm耳机座; Current Rating (Max): 500mA; Voltage Rating (Max): 30V; Operating Temperature Range: -20℃~+70℃; Welding Temperature (Max): 235℃
LED12 = XL-1005BGWC: 发光颜色:-;正向压降(Vf):3.3V;功率:70mW;正向电流:20mA;波长:-;二极管配置:-;透镜颜色:-;色温:-;发光强度:1000mcd;发光角度:120°;载带方式:正贴;工作温度:-20℃~+85℃;; LCSC Part Name: XL-1005BGWC 停产; Supplier Part: C965797; Manufacturer: XINGLIGHT(成兴光); Supplier Footprint: 0402; JLCPCB Part Class: 扩展库; Datasheet: https://atta.szlcsc.com/upload/public/pdf/source/20240218/448D33B83DECD1CFAD36DE601F7DDA91.pdf; Supplier: LCSC; Voltage - Forward(Vf): 3.3V; Power(Watts): 70mW; Forward Current: 20mA; Luminous Intensity: 1000mcd; Viewing Angle: 120°; Mounting Sytle: 正贴; Operating Temperature: -20℃~+85℃
Q2 = AO3400A_C20917: 数量:-;漏源电压(Vdss):30V;连续漏极电流(Id):-;导通电阻(RDS(on)):48mΩ@2.5V;耗散功率(Pd):-;阈值电压(Vgs(th)):1.45V@250uA;; LCSC Part Name: 1个N沟道 耐压:30V 电流:5.7A; Supplier Part: C20917; Manufacturer: AOS; Supplier Footprint: SOT-23-3L; JLCPCB Part Class: Basic Part; Datasheet: https://item.szlcsc.com/datasheet/AO3400A/21629.html; Supplier: LCSC; Drain to Source Voltage: 30V; RDS(on): 48mΩ@2.5V; Gate Threshold Voltage (Vgs(th)): 1.45V@250uA; Gate Charge(Qg): 7nC@10V; Input Capacitance(Ciss): 630pF@15V; Operating Temperature: -55℃~+150℃@(Tj); Type: N沟道
R451 = 0402WGF4700TCE: 电阻类型:厚膜电阻;阻值:470Ω;精度:±1%;功率:62.5mW;最大工作电压:50V;温度系数:±100ppm/℃;; LCSC Part Name: 470Ω ±1% 62.5mW 厚膜电阻; Supplier Part: C25117; Manufacturer: UNI-ROYAL(厚声); Supplier Footprint: 0402; JLCPCB Part Class: 基础库; Datasheet: https://atta.szlcsc.com/upload/public/pdf/source/20200306/C422600_1E6D84923E4A46A82E41ADD87F860B5C.pdf; Supplier: LCSC; Type: 厚膜电阻; Tolerance: ±1%; Power(Watts): 62.5mW; Overload Voltage (Max): 50V; Temperature Coefficient: ±100ppm/℃; Operating Temperature Range: -55℃~+155℃
R15 R19 R33 R59 R86 R88 R169 R253 R274 R408 R468 R481-R483 = Res_0402: Supplier Footprint: 0402
U1 = ATE700Q
U35-U38 U52 U53 U116 U117 U153 U154 = ESD5451N: Supplier: LCSC; Datasheet: https://atta.szlcsc.com/upload/public/pdf/source/20211227/D040CF3F0222548C5BD9F7E690946783.pdf; Manufacturer: TECH PUBLIC(台舟); Supplier Part: C2936977; JLCPCB Part Class: 扩展库; Check: false
H5 = A2541HWR-2x6P_C5333437: 插孔结构:2x6P;间距:2.54mm;行距:2.54mm;圆孔/方孔:方孔;安装类型:弯插;排数:双排;总孔位数:12P;额定电流:3A;额定电压:250V;插孔方向:侧面;塑高:5mm;触头材质:黄铜;触头镀层:金;工作温度范围:-40℃~+105℃;; LCSC Part Name: 2x6P 间距:2.54mm 弯插; Supplier Part: C5333437; Manufacturer: CJT(长江连接器); Supplier Footprint: 弯插,P=2.54mm; JLCPCB Part Class: 扩展库; Datasheet: https://atta.szlcsc.com/upload/public/pdf/source/20190522/C339348_148DC62DFEE35B66DE27661541078F4A.pdf; Supplier: LCSC; Holes Structure: 2x6P; Pitch: 2.54mm; Row Spacing: 2.54mm; Circular Hole / Square Hole: 方孔; Mounting Type: 弯插; Number of Rows: 双排; Number of Holes: 12P; Current Rating (Max): 3A; Voltage Rating (Max): 250V; Holes Direction: 侧面; Insulation Height: 5mm; Contact Material: 黄铜; Contact Plating: 金; Operating Temperature Range: -40℃~+105℃; PIN Length: 3.2mm
U74 = CH347T: Supplier Part: C5122332; Manufacturer: WCH(南京沁恒); Supplier Footprint: TSSOP-20; JLCPCB Part Class: 扩展库; Datasheet: https://atta.szlcsc.com/upload/public/pdf/source/20220727/C146BDC59808820E6CF38786842D37DD.pdf; Supplier: LCSC
U120 U121 = SMTSO2520CTJ: M2.5x5.56xL2+1.53; LCSC Part Name: 雄和远景，电路板表贴圆螺母柱，M2.5X2，铜镀锡,1个; Supplier Part: C2915630; Manufacturer: Sinhoo(雄和远景); JLCPCB Part Class: 扩展库; Datasheet: https://atta.szlcsc.com/upload/public/pdf/source/20211122/17CF5E24EB4D4DC090A80DE3D7DE5E21.pdf; Supplier: LCSC; specifications: M2.5X2; surface treatment: 镀锡; brand: Sinhoo(雄和远景)
X13 = TAXM8M4RDBCCT2T: 晶振类型:贴片晶振;频率:8MHz;常温频差:±10ppm;负载电容:10pF;频率稳定度:±15ppm;; LCSC Part Name: 8MHz ±10ppm 10pF; Supplier Part: C400090; Manufacturer: YJX(雅晶鑫); Supplier Footprint: SMD3225-4P; JLCPCB Part Class: 扩展库; Datasheet: https://atta.szlcsc.com/upload/public/pdf/source/20190626/C400090_CF95B89E745AFE4EF2E392EF8AC009D6.pdf; Supplier: LCSC; Type: 贴片晶振; Normal temperature Frequency Tolerance: ±10ppm; Load Capacitance: 10pF; Frequency Stability: ±15ppm; Equivalent Series Resistance(ESR): 250Ω; Operating Temperature: -40℃~+85℃
C122 C135 C137 C143 C145 = CL05A475MQ5NRNC: 容值:4.7uF;精度:±20%;额定电压:6.3V;材质(温度系数):X5R;; LCSC Part Name: 4.7uF ±20% 6.3V; Supplier Part: C307423; Manufacturer: SAMSUNG(三星); Supplier Footprint: 0402; JLCPCB Part Class: Extended Part; Datasheet: https://atta.szlcsc.com/upload/public/pdf/source/20181010/C307423_0E0C4E35F3A09F81C2E5C84E00499E42.pdf; Supplier: LCSC; Tolerance: ±20%; Voltage Rated: 6.3V; Temperature Coefficient: X5R
C123 C129 C130 C136 C138-C141 C144 C146 C162-C164 C287-C298 C335 = CC0402KRX7R7BB104: 容值:100nF;精度:±10%;额定电压:16V;材质(温度系数):X7R;; LCSC Part Name: 100nF ±10% 16V; Supplier Part: C60474; Manufacturer: YAGEO(国巨); Supplier Footprint: 0402; JLCPCB Part Class: Extended Part; Datasheet: https://atta.szlcsc.com/upload/public/pdf/source/20211223/9278FD768280B81DDBEF48FA36411A03.pdf; Supplier: LCSC; Tolerance: ±10%; Voltage Rated: 16V; Temperature Coefficient: X7R
C131 C132 C332-C334 C425 C426 C557 C558 C561-C563 = CL05B104KB54PNC: 容值:100nF;精度:±10%;额定电压:50V;温度系数:X7R;; LCSC Part Name: 100nF ±10% 50V; Supplier Part: C307331; Manufacturer: SAMSUNG(三星); Supplier Footprint: 0402; JLCPCB Part Class: Extended Part; Datasheet: https://atta.szlcsc.com/upload/public/pdf/source/20181009/C307331_222F7C870FD3EA5F46F538B483443886.pdf; Supplier: LCSC; Tolerance: ±10%; Voltage Rated: 50V; Temperature Coefficient: X7R
C427-C434 = GRM033R61A224KE90D: 容值:220nF;精度:±10%;额定电压:10V;材质(温度系数):X5R;; LCSC Part Name: 220nF ±10% 10V; Supplier Part: C76936; Manufacturer: muRata(村田); Supplier Footprint: 0201; JLCPCB Part Class: 扩展库; Datasheet: https://atta.szlcsc.com/upload/public/pdf/source/20180307/C76936_15204090991961407724.pdf; Supplier: LCSC; Tolerance: ±10%; Voltage Rated: 10V; Temperature Coefficient: X5R
D2 D3 D14 = AZ1045-04F.R7G: LCSC Part Name: ESD 编带; Supplier Part: C356811; Manufacturer: AMAZING(晶焱); Supplier Footprint: DFN2510P10E; JLCPCB Part Class: 扩展库; Datasheet: https://atta.szlcsc.comnull; Supplier: LCSC
D7 = 1N5819WS_C191023: 直流反向耐压(Vr):40V;平均整流电流(Io):1A;正向压降(Vf):600mV@1A;; LCSC Part Name: 40V 1A 600mV@1A; Supplier Part: C191023; Manufacturer: Hottech(合科泰); Supplier Footprint: SOD-323; JLCPCB Part Class: 基础库; Datasheet: https://atta.szlcsc.com/upload/public/pdf/source/20180614/C191023_3C6A6398B911F3A4C23E7538EE054643.pdf; Supplier: LCSC; Reverse Voltage (Vr): 40V; Average Rectified Current (Io): 1A; Forward Voltage (Vf@If): 600mV@1A
R130 R240 = 0402WGF2201TCE: 电阻类型:厚膜电阻;阻值:2.2kΩ;精度:±1%;功率:62.5mW;最大工作电压:50V;温度系数:±100ppm/℃;; LCSC Part Name: 2.2kΩ ±1% 62.5mW 厚膜电阻; Supplier Part: C25879; Manufacturer: UNI-ROYAL(厚声); Supplier Footprint: 0402; JLCPCB Part Class: 基础库; Datasheet: https://atta.szlcsc.com/upload/public/pdf/source/20200306/C422600_1E6D84923E4A46A82E41ADD87F860B5C.pdf; Supplier: LCSC; Type: 厚膜电阻; Tolerance: ±1%; Power(Watts): 62.5mW; Overload Voltage (Max): 50V; Temperature Coefficient: ±100ppm/℃; Operating Temperature Range: -55℃~+155℃
R229 = 0603WAF200KT5E: 电阻类型:厚膜电阻;阻值:2Ω;精度:±1%;功率:100mW;最大工作电压:75V;温度系数:±200ppm/℃;; LCSC Part Name: 2Ω ±1% 100mW 厚膜电阻; Supplier Part: C22977; Manufacturer: UNI-ROYAL(厚声); Supplier Footprint: 0603; JLCPCB Part Class: 基础库; Datasheet: https://atta.szlcsc.com/upload/public/pdf/source/20200306/C422600_1E6D84923E4A46A82E41ADD87F860B5C.pdf; Supplier: LCSC; Type: 厚膜电阻; Tolerance: ±1%; Power(Watts): 100mW; Overload Voltage (Max): 75V; Temperature Coefficient: ±200ppm/℃; Operating Temperature Range: -55℃~+155℃
R230 R231 = 0402WGF1001TCE: 阻值:1kΩ;精度:±1%;功率:62.5mW;温度系数:±100ppm/℃;电阻类型:厚膜电阻;; LCSC Part Name: 1kΩ ±1% 62.5mW 厚膜电阻; Supplier Part: C11702; Manufacturer: UNI-ROYAL(厚声); Supplier Footprint: 0402; JLCPCB Part Class: Basic Part; Datasheet: https://atta.szlcsc.com/upload/public/pdf/source/20200306/C422600_1E6D84923E4A46A82E41ADD87F860B5C.pdf; Supplier: LCSC; Tolerance: ±1%; Power(Watts): 62.5mW; Overload Voltage (Max): 50V; Temperature Coefficient: ±100ppm/℃; Type: 厚膜电阻; Operating Temperature Range: -55℃~+155℃
R232 = 0402WGF1002TCE: 功率:1/16W;精度:±1%;温度系数:±100ppm/℃;阻值:10kΩ;最大工作电压:50V;工作温度范围:-55℃~+155℃;; LCSC Part Name: 10KΩ ±1%; Supplier Part: C25744; Manufacturer: UNI-ROYAL(厚声); Supplier Footprint: 0402; JLCPCB Part Class: Basic Part; Datasheet: https://atta.szlcsc.com/upload/public/pdf/source/20170920/C25744_1505901522148983320.pdf; Supplier: LCSC; Power(Watts): 1/16W; Tolerance: ±1%; Temperature Coefficient: ±100ppm/℃; Overload Voltage (Max): 50V; Operating Temperature Range: -55℃~+155℃
R237-R239 = 0402WGF0000TCE: 电阻类型:厚膜电阻;阻值:0Ω;精度:±1%;功率:62.5mW;最大工作电压:50V;温度系数:±800ppm/℃;; LCSC Part Name: 0Ω ±1% 62.5mW 厚膜电阻; Supplier Part: C17168; Manufacturer: UNI-ROYAL(厚声); Supplier Footprint: 0402; JLCPCB Part Class: 基础库; Datasheet: https://atta.szlcsc.com/upload/public/pdf/source/20200306/C422600_1E6D84923E4A46A82E41ADD87F860B5C.pdf; Supplier: LCSC; Type: 厚膜电阻; Tolerance: ±1%; Power(Watts): 62.5mW; Overload Voltage (Max): 50V; Temperature Coefficient: ±800ppm/℃; Operating Temperature Range: -55℃~+155℃
R332-R339 = Res_0201: Supplier Footprint: 0201
U98 = CS5266AN: Supplier Part: C9900040338; Supplier Footprint: QFN-68_8X8; JLCPCB Part Class: 扩展库; Supplier: LCSC
U150 X14 X15 = XL7EL89CKI-111YLC-25M: 晶振类型:贴片晶振;频率:25MHz;常温频差:±10ppm;外接负载电容:8pF;频率稳定度(全温):±20ppm;; LCSC Part Name: 25MHZ 8PF ±10PPM YSX211SL; Supplier Part: C19711739; Manufacturer: YXC(扬兴晶振); Supplier Footprint: SMD2016-4P; JLCPCB Part Class: 扩展库; Datasheet: https://atta.szlcsc.com/upload/public/pdf/source/20240329/C26C9A15A73CBCFBF373B30A8E126750.pdf; Supplier: LCSC; Crystal Type: 贴片晶振; Normal temperature Frequency Tolerance: ±10ppm; External load capacitor: 8pF; Frequency Stability(Full temperature range): ±20ppm; Operating Temperature: -40℃~+85℃
USB1 = U-C-19DD-W-1: Supplier Part: C2909254; Manufacturer: 韩国韩荣; Supplier Footprint: 弯插; Datasheet: https://atta.szlcsc.com/upload/public/pdf/source/20211028/2CE5D11B10CDB76F54118B182A57752F.pdf; Supplier: LCSC; Connector Type: HDMI-A; Gender: 母; Number of Pins: 19P; Mounting Style: 沉板
C377 = CL05A106MP5NUNC: 容值:10uF;精度:±20%;额定电压:10V;材质(温度系数):X5R;; LCSC Part Name: 10uF ±20% 10V; Supplier Part: C315248; Manufacturer: SAMSUNG(三星); Supplier Footprint: 0402; JLCPCB Part Class: Extended Part; Datasheet: https://atta.szlcsc.com/upload/public/pdf/source/20200102/C478861_C4302703595930F3C0E62DAD3349F1AA.pdf; Supplier: LCSC; Tolerance: ±20%; Voltage Rated: 10V; Temperature Coefficient: X5R
D24 = 1N5819WS_C191023: 正向压降(Vf):600mV@1A;直流反向耐压(Vr):40V;平均整流电流(Io):1A;; LCSC Part Name: 电压:40V 电流:1A; Supplier Part: C191023; Manufacturer: Hottech(合科泰); Supplier Footprint: SOD-323; JLCPCB Part Class: 基础库; Datasheet: https://atta.szlcsc.com/upload/public/pdf/source/20220428/3CB86FD8D28D653594B4E35F9D5AEFD9.pdf; Supplier: LCSC; Forward Voltage (Vf@If): 600mV@1A; Reverse Voltage (Vr): 40V; Average Rectified Current (Io): 1A
FPC1 = GT-F0509SR15-15SMT01: 锁定特性:翻盖式;触点类型:下接;触点数量:15P;间距:0.5mm;安装类型:卧贴;工作温度范围:-25℃~+85℃;; LCSC Part Name: 翻盖式 下接 P数:15P 间距:0.5mm; Supplier Part: C21882324; Manufacturer: G-Switch(品赞); Supplier Footprint: SMD,P=0.5mm,卧贴; JLCPCB Part Class: Extended Part; Datasheet: https://atta.szlcsc.com/upload/public/pdf/source/20240320/B920DDA4D6BBFA17D7F9542D518DEFAA.pdf; Supplier: LCSC; Locking Feature: 翻盖式; Contact Type: 下接; Number of Contacts: 15P; Pitch: 0.5mm; Mounting Type: 卧贴; FFC, FCB Thickness: 0.3mm; Height Above Board: 1.53mm; Contact Material: 磷青铜; Contact Plating: 锡; Operating Temperature Range: -25℃~+85℃
L4 = FTC252012S100MBCA: 电感值:10uH;精度:±20%;额定电流:1.2A;饱和电流(Isat):1.6A;类型:一体成型电感;; LCSC Part Name: 10uH ±20% 1.6A; Supplier Part: C5832376; Manufacturer: cjiang(长江微电); Supplier Footprint: SMD,2x2.5mm; JLCPCB Part Class: 扩展库; Datasheet: https://atta.szlcsc.com/upload/public/pdf/source/20230602/8FFEDA9C0247A92A0D4B67554BFE4091.pdf; Supplier: LCSC; Tolerance: ±20%; Rated Current: 1.2A; Saturation Current (Isat): 1.6A; DC Resistance (DCR): 330mΩ; Type: 一体成型电感
U108 = SY7200AABC: 30V 2A LED驱动 升压 效率高达96% 软启动 LED开路保护; Supplier Part: C107309; Manufacturer: silergy(矽力杰); Supplier Footprint: SOT-23-6; JLCPCB Part Class: 扩展库; Datasheet: https://atta.szlcsc.com/upload/public/pdf/source/20170925/C107309_1506321334417990079.pdf; Supplier: LCSC
U156 = RS0108YTQC20: 数据速率:24Mbps;工作电压(VCCA):1.65V~5.5V;工作电压(VCCB):2.3V~5.5V;每个电路通道数:8;; Supplier Part: C5129983; Manufacturer: RUNIC(润石); Supplier Footprint: QFN-20L(3x3); JLCPCB Part Class: Extended Part; Datasheet: https://item.szlcsc.com/datasheet/RS0108YTQC20/5743603.html; Supplier: LCSC; Channel Type: 双向; Data Rate: 24Mbps; Voltage - Supply(VCCA): 1.65V~5.5V; Voltage - Supply(VCCB): 2.3V~5.5V; Number of Circuits: 8; Output Type: 三态; Operating Temperature: -40℃~+85℃
C545 C546 C559 = 0402CG150J500NT: 容值:15pF;精度:±5%;额定电压:50V;材质(温度系数):C0G;; LCSC Part Name: 15pF ±5% 50V; Supplier Part: C1548; Manufacturer: FH(风华); Supplier Footprint: 0402; JLCPCB Part Class: 基础库; Datasheet: https://atta.szlcsc.com/upload/public/pdf/source/20200305/C486355_26A10D38EF8C2A5C37091D0039909270.pdf; Supplier: LCSC; Tolerance: ±5%; Voltage Rated: 50V; Temperature Coefficient: C0G
C549 = 1206B102K202NT: 容值:1nF;精度:±10%;额定电压:2kV;温度系数:X7R;; LCSC Part Name: 1nF ±10% 2kV; Supplier Part: C9196; Manufacturer: FH(风华); Supplier Footprint: 1206; JLCPCB Part Class: Basic Part; Datasheet: https://atta.szlcsc.com/upload/public/pdf/source/20200305/C486355_26A10D38EF8C2A5C37091D0039909270.pdf; Supplier: LCSC; Tolerance: ±10%; Voltage Rating: 2kV; Temperature Coefficient: X7R
C550 C551 = CAP_0603: Supplier Footprint: 0603
L35 = HX0068ANLTP: 匝数比:1:1;端口数量:单口;速率:100M;; Supplier Part: C47575003; Manufacturer: CND-tek(磁联达); Supplier Footprint: SMD-12P,12.7x8.8mm; JLCPCB Part Class: Extended Part; Datasheet: https://item.szlcsc.com/datasheet/HX0068ANLTP/49805147.html; Supplier: LCSC; Turns Ratio: 1:1; Number of Channels: 单口; rate: 100M; Isolation Voltage(Vrms): 1.5kV; operating temperature: -40℃~+85℃
R475-R478 = Res_0603: Supplier Footprint: 0603
RJ1 = X39ADAB1W6DB1075: 连接器类型:RJ45插座;端口数量:1;安装方式:沉板;屏蔽:有屏蔽;LED:带LED;触头材质:磷青铜;触头镀层:金;工作温度范围:-40℃~+85℃;焊接温度(最大值):260℃;; LCSC Part Name: 沉板 带LED; Supplier Part: C2916463; Manufacturer: XKB Connection(中国星坤); Supplier Footprint: 插件; Datasheet: https://atta.szlcsc.com/upload/public/pdf/source/20211125/05B21C550A9EA1E4C35955615748037B.pdf; Supplier: LCSC; Connector Type: RJ45插座; Number of Ports: 1; Mounting Style: 沉板; Shielding: 有屏蔽; LED: 带LED; Contact Material: 磷青铜; Contact Plating: 金; Operating Temperature Range: -40℃~+85℃; Soldering Temperature(Max): 260℃
U158 = CH397A: 应用功能:USB转以太网;USB协议版本:USB 2.1；USB 2.0;通道数:-;数据速率:100Mbps;; Supplier Part: C7465328; Manufacturer: WCH(南京沁恒); Supplier Footprint: QFN-24(4x4); JLCPCB Part Class: Extended Part; Datasheet: https://item.szlcsc.com/datasheet/CH397A/8506359.html; Supplier: LCSC; Applications Function: USB转以太网; USB Protocol: USB 2.1；USB 2.0; Voltage - Supply: 3.3V；5V; Data Rate: 100Mbps; Operating Temperature: -40℃~+85℃
C552-C555 = GCM155R71C104KA55J: 容值:100nF;精度:±10%;额定电压:-;材质(温度系数):-;; LCSC Part Name: 100nF ±10%; Supplier Part: C2655418; Manufacturer: muRata(村田); Supplier Footprint: 0402; JLCPCB Part Class: 扩展库; Datasheet: https://atta.szlcsc.com/upload/public/pdf/source/20210701/42090801FDE37D0E45AFF657247F4A08.pdf; Supplier: LCSC; Tolerance: ±10%
C556 = 0402X225M6R3CT: 温度系数:X5R;额定电压:6.3V;容值:2.2uF;电容体长:-;电容体宽:-;电容体厚度:-;精度:±20%;; LCSC Part Name: 2.2uF ±20% 6.3V; Supplier Part: C295944; Manufacturer: Walsin(华新科); Supplier Footprint: 0402; JLCPCB Part Class: Extended Part; Datasheet: https://atta.szlcsc.com/upload/public/pdf/source/20180926/C295944_83E46F3CE40F59B316DD508BCCE2E263.pdf; Supplier: LCSC; Temperature Coefficient: X5R; Voltage Rated: 6.3V; Tolerance: ±20%
C565 C566 = TA6R3M220A: 容值:220uF;精度:±20%;额定电压:6.3V;等效串联电阻(ESR):18mΩ@100kHz;; LCSC Part Name: 220uF ±20% 6.3V; Supplier Part: C49332975; Manufacturer: JIERR(捷而瑞); Supplier Footprint: CASE-A-7343-19(mm); JLCPCB Part Class: Extended Part; Datasheet: https://item.szlcsc.com/datasheet/TA6R3M220A/51817329.html; Supplier: LCSC; Tolerance: ±20%; Voltage Rating: 6.3V; Current - Leakage: 138.6uA@20℃,2min; Ripple Current: 5.1A@100kHz; Equivalent Series Resistance(ESR): 18mΩ@100kHz; Operating Temperature: -55℃~+105℃
D15 D16 D28 = PGB1010603MR: 极性:双向;反向截止电压(Vrwm):24V;最大钳位电压:150V;; LCSC Part Name: 双向ESD; Supplier Part: C142698; Manufacturer: Littelfuse(美国力特); Supplier Footprint: 0603; JLCPCB Part Class: 扩展库; Datasheet: https://atta.szlcsc.com/upload/public/pdf/source/20171109/C142698_15102199377211103373.pdf; Supplier: LCSC; polarity: 双向; Reverse Stand-Off Voltage (Vrwm): 24V; Maximum Clamping Voltage: 150V; Number of Lines: 单路; Type: ESD
F1-F3 = SMD1206-100-24: 耐压(Vmax):24V;最大电流(Imax):40A;保持电流(Ihold):1A;跳闸电流(Itrip):1.8A;; Supplier Part: C46641025; Manufacturer: R+O(宏嘉诚); Supplier Footprint: 1206; JLCPCB Part Class: Extended Part; Datasheet: https://item.szlcsc.com/datasheet/SMD1206-100-24/48798731.html; Supplier: LCSC; Voltage - Max: 24V; Current - Max: 40A; Hold Current: 1A; Trip Current: 1.8A; Power Dissipation: 1W; Resistance - Initial (Ri) (Min): 50mΩ; Resistance - Post Trip (R1) (Max): 300mΩ; Time to Trip(Max): 300ms; Operating Temperature: -40℃~+85℃; Length: 3.6mm; Width: 1.9mm; Height: 1.3mm
R23 R24 R194 R195 = 0402WGF1004TCE: 电阻类型:厚膜电阻;阻值:1MΩ;精度:±1%;功率:62.5mW;最大工作电压:50V;温度系数:±100ppm/℃;; LCSC Part Name: 1MΩ ±1% 62.5mW 厚膜电阻; Supplier Part: C26083; Manufacturer: UNI-ROYAL(厚声); Supplier Footprint: 0402; JLCPCB Part Class: Basic Part; Datasheet: https://atta.szlcsc.com/upload/public/pdf/source/20200306/C422600_1E6D84923E4A46A82E41ADD87F860B5C.pdf; Supplier: LCSC; Type: 厚膜电阻; Tolerance: ±1%; Power(Watts): 62.5mW; Overload Voltage (Max): 50V; Temperature Coefficient: ±100ppm/℃; Operating Temperature Range: -55℃~+155℃
R25 R26 R28 = RC0402FR-0710KL: 电阻类型:厚膜电阻;阻值:10kΩ;精度:±1%;功率:62.5mW;; LCSC Part Name: 10kΩ ±1% 62.5mW; Supplier Part: C60490; Manufacturer: YAGEO(国巨); Supplier Footprint: 0402; JLCPCB Part Class: Extended Part; Datasheet: https://atta.szlcsc.com/upload/public/pdf/source/20170606/1496716515432.pdf; Supplier: LCSC; Type: 厚膜电阻; Tolerance: ±1%; Power(Watts): 62.5mW; Temperature Coefficient: ±100ppm/℃; Overload Voltage (Max): 50V; Operating Temperature Range: -55℃~+155℃
R29 R30 = 0402WGF2004TCE: 电阻类型:厚膜电阻;阻值:2MΩ;精度:±1%;功率:62.5mW;最大工作电压:50V;温度系数:±100ppm/℃;; LCSC Part Name: 2MΩ ±1% 62.5mW 厚膜电阻; Supplier Part: C11512; Manufacturer: UNI-ROYAL(厚声); Supplier Footprint: 0402; JLCPCB Part Class: 扩展库; Datasheet: https://atta.szlcsc.com/upload/public/pdf/source/20200306/C422600_1E6D84923E4A46A82E41ADD87F860B5C.pdf; Supplier: LCSC; Type: 厚膜电阻; Tolerance: ±1%; Power(Watts): 62.5mW; Overload Voltage (Max): 50V; Temperature Coefficient: ±100ppm/℃; Operating Temperature Range: -55℃~+155℃
TP31 TP32 = Test-Point: Test Point 测试点
U12 U13/NC1 U16 = 0402: Supplier Part: C9900015844; Supplier Footprint: R0402; JLCPCB Part Class: 扩展库; Datasheet: https://atta.szlcsc.comnull; Supplier: LCSC
U17 = GL823K-HCY04: link: https://item.szlcsc.com/403588.html; 3DModel: SSOP-16_L4.9-W3.9-H1.75-LS6.0_P0.64; Supplier: LCSC; Supplier Part: C284879; Manufacturer: Genesys Logic; JLCPCB Part Class: Extended Part
U18 = SML-LX0603SRW-TR: Supplier Part: C9900013322; Supplier Footprint: LED_0603; JLCPCB Part Class: Extended Part; Datasheet: https://atta.szlcsc.comnull; Supplier: LCSC
U19 = CSNP4GCR01-BOW: 免驱动使用，标准SDIO接口，兼容SPI/SD/eMMC接口，兼容各大MCU平台;内置EDC/ECC，坏块管理，垃圾回收算法;可机贴，锁定晶圆和控制器,一致性高；内置SLC晶圆,10W次擦写寿命，通过1万次随机掉电测试，支持工业级温度-40°~+85°。 CS(创世) SD NAND也被很多开发者朋友称为：贴片式TF卡，贴片式SD卡，贴片卡，焊接式SD卡，焊接式TF卡，工业级TF卡，工业级SD卡，嵌入式SD卡等。主要解决了主控(比如STM32系列的MCU单片机 )使用 SLC NAND FLASH,SPI; LCSC Part Name: 4Gb SD NAND 一代; Supplier Part: C2691595; Manufacturer: CS(创世); Supplier Footprint: LGA8-6*8mm; JLCPCB Part Class: 扩展库; Datasheet: https://atta.szlcsc.com/upload/public/pdf/source/20210222/C2691595_CEF59AF255D4BCF0036858007B04A3F9.pdf; Supplier: LCSC
U92 = VL170: Pin Type: IN; Supplier: LCSC; Supplier Part: C2940040; Manufacturer: null; JLCPCB Part Class: 扩展库
U118 = RS2227XN: 开关电路:-;多路复用器/解复用器电路:-;导通电阻（最大值）:-;开关电压（最大值）:-;; LCSC Part Name: 模拟开关RS2227XN; Supplier Part: C255478; Manufacturer: RUNIC(润石); Supplier Footprint: MSOP-10; JLCPCB Part Class: 扩展库; Datasheet: https://atta.szlcsc.com/upload/public/pdf/watermark/20190926/C255478_D49089ECE2A541195D1EEBCAD82CD8F3.pdf; Supplier: LCSC
U157 = CH338F_C42387425: 工业级7端口USB2.0高速HUB芯片，支持高性能的MTT模式，7个下行口并发处理，支持GANG过流检测与电源控制，支持上行口交换、支持USB延长和隔离，支持Type-C PD，3.3V供电。; Supplier Part: C42387425; Manufacturer: WCH(南京沁恒); Supplier Footprint: QFN-32(4x4); JLCPCB Part Class: Extended Part; Datasheet: https://item.szlcsc.com/datasheet/CH338F/44310770.html; Supplier: LCSC
USB9 USB10 USB16 = HC-ST-003-008-Z: 连接器类型:Type-A;标准:USB 3.0;公母:母;安装方式:沉板;触点数量:9P;端口数量:1;额定电流 - 电源:1.5A;触头材质:铜;触头镀层:锡;工作温度范围:-25℃~+70℃;焊接温度(最大值):260℃;; LCSC Part Name: Type-A 母 沉板; Supplier Part: C2845342; Manufacturer: HCTL(华灿天禄); Supplier Footprint: SMD; JLCPCB Part Class: 扩展库; Datasheet: https://atta.szlcsc.com/upload/public/pdf/source/20221116/23F6C6B7F36FAB328F0F8E0B4004CAEF.pdf; Supplier: LCSC; Connector Type: Type-A; Standard: USB 3.0; Gender: 母; Mounting Style: 沉板; Number of Contacts: 9P; Number of Ports: 1; Current Rating - Power (Max): 1.5A; Contact Material: 铜; Contact Plating: 锡; Operating Temperature Range: -25℃~+70℃; Soldering Temperature(Max): 260℃
USB11 = TYPE-C 24P QCHT: 连接器类型:Type-C;标准:USB 3.1;公母:母;安装方式:卧贴;触点数量:24P;端口数量:1;额定电流 - 电源:3A;工作温度范围:-40℃~+85℃;; LCSC Part Name: Type-C 母 卧贴; Supplier Part: C456013; Manufacturer: SHOU HAN(首韩); Supplier Footprint: SMD; JLCPCB Part Class: Extended Part; Datasheet: https://atta.szlcsc.com/upload/public/pdf/source/20191113/C456013_92427D6B1C851D10A4627E39D5976A1B.pdf; Supplier: LCSC; Connector Type: Type-C; Standard: USB 3.1; Gender: 母; Mounting Style: 卧贴; Number of Contacts: 24P; Number of Ports: 1; Current Rating - Power (Max): 3A; Operating Temperature Range: -40℃~+85℃; Rated Voltage (Max): 30V; Connect-Disconnect Life: 1万次; Core Colour: 黑色

## Nets
1V8_HDMI: C129.1 C130.1 C131.1 C132.1 C332.1 C333.1 C334.1 U98.1(AVDD18) U98.2(AVDD18) U98.13(AVDD18) U98.16(AVDD18) U98.27(VDD18) U98.36(AVDD18) U98.42(AVDD18) U98.48(AVDD18) ; also on sheet 2
3V3_HDMI_MUX: C145.1 C146.1 R130.1 R232.1 R240.1 U98.28(V33_IO) ; also on sheet 2
3V3_HUB: C422.1 C557.1 C558.1 C562.1 R24.2 R25.1 R28.2 U92.22(VCC) U157.5(VDD33) U157.19(VDD33) ; also on sheet 2
3V3_NAT: C540.2 C541.2 C542.2 C543.2 C544.2 C564.2 R86.1 R88.1 U158.1(AVDD33) U158.10(AVDD33) U158.11(V5) U158.13(VDDIO) U158.18(VDDIO) ; also on sheet 2
3V3_WIFI_TFT_CH347: C244.1 FPC1.6 FPC1.12 L4.2 R169.2 U74.14(VCC) U108.4(EN/PWM) U108.6(IN) U156.17(VCCB) ; also on sheet 2 3
+0.9V_DP: C137.1 C138.1 C139.1 C164.1 U98.20(DVDD09) U98.58(DVDD09) U98.66(V09_IO)
+1.2V_DP: C135.1 C136.1 C140.1 C141.1 C162.1 C163.1 C335.1 U98.7(AVDD12) U98.12(AVDD12) U98.17(AVDD12) U98.37(AVDD_12) U98.47(AVDD12) U98.67(AVDD12) U98.68(V12_IO)
GND: C21.1 C22.1 C33.1 C34.1 C122.2 C123.2 C129.2 C130.2 C131.2 C132.2 C135.2 C136.2 C137.2 C138.2 C139.2 C140.2 C141.2 C143.2 C144.2 C145.2 C146.2 C157.1 C162.2 C163.2 C164.2 C243.1 C244.2 C332.2 C333.2 C334.2 C335.2 C336.1 C337.1 C377.2 C420.2 C421.2 C422.2 C437.2 C438.2 C528.1 C529.1 C530.1 C535.1 C536.1 C537.1 C538.1 C539.1 C540.1 C541.1 C542.1 C543.1 C544.1 C545.1 C546.2 C547.2 C549.1 C550.2 C551.2 C552.1 C553.1 C554.1 C555.1 C556.2 C557.2 C558.2 C559.1 C561.2 C562.2 C563.1 C564.1 C565.1 C566.1 D2.3(GND) D2.8(GND) D3.3(GND) D3.8(GND) D14.3(GND) D14.8(GND) D15.1 D16.1 D28.1 FPC1.5 FPC1.15 FPC1.16 FPC1.17 H5.6 H5.8 LED12.1(K) R23.2 R26.1 R29.2 R30.2 R33.1 R231.2 R232.2 R274.1 R408.1 R481.2 RJ1.13 RJ1.14 U1.13(JD0) U1.14(GND) U1.21(EP) U12.1 U17.1(VSS) U17.14(VSS) U19.4(VSS) U35.1(K) U36.1(K) U37.1(K) U38.1(K) U52.1(K) U53.1(K) U74.18(GND) U92.29(GND) U98.69(EP) U108.2(GND) U116.1(K) U117.1(K) U118.5(GND) U118.10(#OE) U120.1 U121.1 U150.2(GND) U150.4(GND) U153.1(K) U154.1(K) U156.9(GND) U156.21(GND) U157.33(EP) U158.6(GND) U158.24(GND) U158.25(GND) USB1.2(TMDS DATA2 Shield) USB1.5(TMDS DATA1 Shield) USB1.8(TMDS DATA0 Shield) USB1.11(TMDS Clock Shield) USB1.17(DDC/CEC GND) USB1.20(EH) USB1.21(EH) USB1.22(EH) USB1.23(EH) USB9.4(GND) USB9.7(GND_DRAIN) USB9.10(SHELL) USB10.4(GND) USB10.7(GND_DRAIN) USB10.10(SHELL) USB11.25(EH) USB11.A1(GND) USB11.A12(GND) USB11.B1(GND) USB11.B12(GND) USB16.4(GND) USB16.7(GND_DRAIN) USB16.10(SHELL) X13.2 X13.4 X14.2(GND) X14.4(GND) X15.2(GND) X15.4(GND) ; also on sheet 1 2 3
VBAT_5V: C33.2 C34.2 C565.2 C566.2 F1.1 F2.1 F3.1 H5.2 H5.4 Q2.3(D) U17.10(5V) U118.1(V+) ; also on sheet 2
VBUS_MON_D: U98.24(VBUS_MON_D) ; also on sheet 2
VBUS_MON_U: U98.23(VBUS_MON_U) ; also on sheet 2
VBUS_UP: USB11.A4(VBUS) USB11.A9(VBUS) USB11.B4(VBUS) USB11.B9(VBUS) ; also on sheet 2
VDD1V8_SYS: U156.8(OE) U156.20(VCCA) ; also on sheet 1 2
VIN_5V: C143.1 C144.1 D7.2(A) R229.2 ; also on sheet 2
#SSRX0+: R15.1 U92.26(SSTX_P)
#SSRX0-: R19.1 U92.25(SSTX_N)
#SSTX0+: C27.1 U92.28(SSRX_P)
#SSTX0-: C28.1 U92.27(SSRX_N)
AU_D+: U1.7(DP) U157.30(DP4)
AU_D-: U1.6(DM) U157.29(DM4)
BB_DN: U98.65(BB_DM) ; also on sheet 2
BB_DP: U98.64(BB_DP) ; also on sheet 2
C_SSRX1+: C294.1 USB11.B11(RX1+)
C_SSRX1-: C293.1 USB11.B10(RX1-)
C_SSRX2+: C288.1 USB11.A11(RX2+)
C_SSRX2-: C287.1 USB11.A10(RX2-)
C_SSTX1+: C292.1 USB11.A2(TX1+)
C_SSTX1-: C291.1 USB11.A3(TX1-)
C_SSTX2+: C290.1 USB11.B2(TX2+)
C_SSTX2-: C289.1 USB11.B3(TX2-)
CAM_SCL: U156.7(A8) ; also on sheet 1
CAM_SCL_3V3: FPC1.1 U156.10(B8)
CAM_SDA: U156.6(A7) ; also on sheet 1
CAM_SDA_3V3: FPC1.2 U156.11(B7)
CH347_CTS0/SCK/TCK: H5.5 U74.6(CTS0/GPIO0/SCK/TCK)
CH347_CTS1: U74.2(CTS1/GPIO6)
CH347_DCD0/ACT/ACT: H5.10 U74.15(DCD0/GPIO4/ACT)
CH347_DSR0/SCS0/TMS: H5.3 U74.5(DSR0/GPIO2/SCS0/TMS)
CH347_DTR0/SCS1/TRST: H5.1 U74.9(TNOW0/DTR0/GPIO5/SCS1/TRST)
CH347_DTR1: U74.10(TNOW1/DTR1) ; also on sheet 1 3
CH347_RI0/SCL/NC: H5.12 U74.11(RI0/GPIO3/SCL)
CH347_RST#: C243.2 R169.1 U74.1(RST#) ; also on sheet 1 3
CH347_RTS0/MISO/TDO: H5.7 U74.7(RTS0/GPIO1/MISO/TDO)
CH347_RTS1: U74.13(RTS1/GPIO7) ; also on sheet 1 3
CH347_RXD0/SDA/NC: H5.11 U74.12(RXD0/SDA)
CH347_RXD1: U74.4(RXD1)
CH347_TXD0/MOSI/TDI: H5.9 U74.8(TXD0/MOSI/TDI)
CH347_TXD1: U74.3(TXD1)
CH347_UD+: U74.17(UD+) U157.32(DP3)
CH347_UD-: U74.16(UD-) U157.31(DM3)
DA+: L35.12(RX+) RJ1.1
DA-: L35.11(RX-) RJ1.2
DB+: L35.8(TX+) RJ1.3
DB-: L35.7(TX-) RJ1.6
DFP_CC1: U98.25(DFP_CC1) ; also on sheet 2
DFP_CC2: U98.26(DFP_CC2) ; also on sheet 2
DOWN_VBUS_DIS: U98.61(DOWN_DISCHARGE) ; also on sheet 2
DOWN_VBUS_EN: U98.62(DOWN_VBUS_EN) ; also on sheet 2
DP_LANE0+: C297.2 U98.3(LANE0_P)
DP_LANE0-: C298.2 U98.4(LANE0_N)
DP_LANE1+: C295.2 U98.5(LANE1_P)
DP_LANE1-: C296.2 U98.6(LANE1_N)
DP_XTAL_IN: C337.2 R253.2 U98.14(XTAL_IN) U150.3
DP_XTAL_OUT: C336.2 R253.1 U98.15(XTAL_OUT) U150.1
GPIO8: R194.2 U98.51(GPIO8)
GPIO9: R195.2 U98.52(GPIO9)
HDMI-5V: C157.2 D7.1(C) R482.2 R483.2 U37.2(A) USB1.18(+5V)
HDMI_CKD_N: C434.2 D3.5(Line-4) D3.6(NC) R339.1 USB1.12(TMDS Clock-)
HDMI_CKD_P: C433.2 D3.4(Line-3) D3.7(NC) R338.1 USB1.10(TMDS Clock+)
HDMI_CKN: C434.1 U98.38(HDMI_CKN)
HDMI_CKP: C433.1 U98.39(HDMI_CKP)
HDMI_D0D_N: C432.2 D3.2(Line-2) D3.9(NC) R337.1 USB1.9(TMDS DATA0-)
HDMI_D0D_P: C431.2 D3.1(Line-1) D3.10(NC) R336.1 USB1.7(TMDS DATA0+)
HDMI_D0N: C432.1 U98.40(HDMI_D0N)
HDMI_D0P: C431.1 U98.41(HDMI_D0P)
HDMI_D1D_N: C430.2 D2.5(Line-4) D2.6(NC) R335.1 USB1.6(TMDS DATA1-)
HDMI_D1D_P: C429.2 D2.4(Line-3) D2.7(NC) R334.1 USB1.4(TMDS DATA1+)
HDMI_D1N: C430.1 U98.43(HDMI_D1N)
HDMI_D1P: C429.1 U98.44(HDMI_D1P)
HDMI_D2D_N: C428.2 D2.2(Line-2) D2.9(NC) R333.1 USB1.3(TMDS DATA2-)
HDMI_D2D_P: C427.2 D2.1(Line-1) D2.10(NC) R332.1 USB1.1(TMDS DATA2+)
HDMI_D2N: C428.1 U98.45(HDMI_D2N)
HDMI_D2P: C427.1 U98.46(HDMI_D2P)
HDMI_HPD: R59.1 R230.2 R408.2
HDMI_SCL: R482.1 U35.2(A) U98.34(HDMI_SCL) USB1.15(SCL)
HDMI_SDA: R483.1 U36.2(A) U98.33(HDMI_SDA) USB1.16(SDA)
HDMI_VT: C122.1 C123.1 R332.2 R333.2 R334.2 R335.2 R336.2 R337.2 R338.2 R339.2 U98.49(HDMI_ISNK)
HPOUT_L: CN2.4 U1.18(HPOUT_L) U154.2(A)
HPOUT_R: CN2.3 U1.17(HPOUT_R) U153.2(A)
HSD0+: U118.9(HSD2+) USB11.A6(D+) USB11.B6(D+)
HSD0-: U118.8(HSD2-) USB11.A7(D-) USB11.B7(D-)
HUB_D+: U118.3(D+) U157.7(DPU)
HUB_D-: U118.4(D-) U157.6(DMU)
LED: R451.1 U1.3(LED)
LED_G: RJ1.9(LED-R-) U158.17(LED1)
LED_Y: RJ1.11(LED-L-) U158.15(LED0)
LEDA: C377.1 D24.1(K) FPC1.13 U108.5(OVP)
LEDK: FPC1.14 R274.2 U108.3(FB)
LNA_N: C298.1 U92.18(LNB_N)
LNA_P: C297.1 U92.19(LNB_P)
LNB_N: C296.1 U92.15(LNA_N)
LNB_P: C295.1 U92.16(LNA_P)
MIC_CAP: C529.2 U1.15(MIC_CAP)
MIC_M: U1.10(MIC_M)
MIC_N: C531.2 U1.12(MICN)
MIC_P: C532.2 U1.11(MICP)
MUTE: U1.4(MUTE)
NAT_D+: U157.2(DP6) U158.8(UDP)
NAT_D-: U157.1(DM6) U158.7(UDM)
OVCUR#: U157.22(OVCUR#)
POL: R28.1 R239.2 U92.3(POL)
PWREN#: R481.1 U157.21(PWREN#)
RC_CD: U12.2 U13/NC1.1 U17.11(GPIO)
RC_CLK: U17.4(CLK) U19.3(SCLK)
RC_CMD: U17.5(CMD) U19.5(CMD)
RC_D0: U17.3(D0) U19.6(SDD0)
RC_D1: U17.2(D1) U19.7(SDD1)
RC_D2: U17.7(D2) U19.1(SDD2)
RC_D3: U17.6(D3) U19.2(CD/SDD3)
RC_GVDD: C553.2 C556.1 U16.2 U17.9(VDD) U17.13(VDDA)
RC_LED: U17.12(LED) U18.1(-)
RC_VCARD: C552.2 C554.2 C555.2 U13/NC1.2 U17.8(PMOS) U19.8(VCC)
RESET#: U157.20(RESET#)
RING2: CN2.2 R468.2 U1.19(RING2)
RING2_C: C531.1 R468.1
RX1+: C294.2 U92.1(RX1_P)
RX1-: C293.2 U92.2(RX1_N)
RX2+: C288.2 U92.9(RX2_P)
RX2-: C287.2 U92.10(RX2_N)
RXN: L35.6(TD-) U158.5(MDIRN)
RXP: L35.5(TD+) U158.4(MDIRP)
SBU1: R29.1 U92.11(CSBU1) USB11.A8(SBU1)
SBU2: R30.1 U92.12(CSBU2) USB11.B8(SBU2)
SD_DM: U17.16(DM) U157.15(DM5)
SD_DP: U17.15(DP) U157.16(DP5)
SLEEVE: C532.1 CN2.1 U1.16(SLEEVE)
SOC_OTG_DM: U118.6(HSD1-) ; also on sheet 1
SOC_OTG_DP: U118.7(HSD1+) ; also on sheet 1
SPI0_CS: U156.1(A2) ; also on sheet 1
SPI0_SCK: U156.2(A3) ; also on sheet 1
SPI0_SDO: U156.3(A4) ; also on sheet 1
SPK_M: U1.9(SPK_M)
SSRX0+: D14.2(Line-2) D14.9(NC) R15.2 USB10.6(SSRX+)
SSRX0-: D14.1(Line-1) D14.10(NC) R19.2 USB10.5(SSRX-)
SSTX0+: C27.2 D14.5(Line-4) D14.6(NC) USB10.9(SSTX+)
SSTX0-: C28.2 D14.4(Line-3) D14.7(NC) USB10.8(SSTX-)
TFT_CS_3V3: FPC1.10 U156.16(B2)
TFT_DC: FPC1.11 ; also on sheet 1
TFT_MOSI_3V3: FPC1.8 U156.14(B4)
TFT_RST: FPC1.7 ; also on sheet 1
TFT_SCK_3V3: FPC1.9 U156.15(B3)
TP0_INT: U156.5(A6) ; also on sheet 1
TP0_INT_3V3: FPC1.3 U156.12(B6)
TP0_RST: U156.4(A5) ; also on sheet 1
TP0_RST_3V3: FPC1.4 U156.13(B5)
TX1+: C292.2 U92.4(TX1_P)
TX1-: C291.2 U92.5(TX1_N)
TX2+: C290.2 U92.6(TX2_P)
TX2-: C289.2 U92.7(TX2_N)
TXN: L35.2(RD-) U158.3(MDITN)
TXP: L35.1(RD+) U158.2(MDITP)
UFP_AUX_N: C425.1 U98.19(AUX_N)
UFP_AUX_P: C426.1 U98.18(AUX_P)
UFP_CC1: C420.1 R237.1 USB11.A5(CC1)
UFP_CC2: C421.1 R238.1 USB11.B5(CC2)
UP_VBUS_DIS: U98.59(UP_VDISCHARGE) ; also on sheet 2
UP_VBUS_EN: U98.60(UP_VBUS_EN) ; also on sheet 2
USB1_5V: C535.2 C536.2 D15.2 F1.2 USB9.1(VBUS)
USB2_5V: C537.2 C538.2 D28.2 F2.2 USB16.1(VBUS)
USB3_5V: C21.2 C539.2 D16.2 F3.2 USB10.1(VBUS)
USBA_D1+: U53.2(A) U157.12(DP1) USB9.3(D+)
USBA_D1-: U52.2(A) U157.11(DM1) USB9.2(D-)
USBA_D2+: U116.2(A) U157.14(DP2) USB16.3(D+)
USBA_D2-: U117.2(A) U157.13(DM2) USB16.2(D-)
USBA_D3+: U157.4(DP7) USB10.3(D+)
USBA_D3-: U157.3(DM7) USB10.2(D-)
WIRED_POW: Q2.1(G) U118.2(S) ; also on sheet 2
$6N9187: R26.2 U92.8(AMSEL)
$6N9188: R25.2 U92.17(EN)
$6N77461: U16.1 U18.2(+)
$6N77472: R33.2 U157.9(XI) X15.3
$6N77477: C559.2 U157.8(XO) X15.1
$6N77478: C561.1 U157.10(AVDDK)
$6N77480: TP31.1 U157.17(SMBDAT)
$6N77481: TP32.1 U157.18(SMBCLK)
$6N77487: C563.2 U157.28(DVDDK)
$7N12050: R86.2 RJ1.12(LED-L+)
$7N12060: R477.2 RJ1.4 RJ1.5
$7N12061: R478.2 RJ1.7 RJ1.8
$7N12062: R88.2 RJ1.10(LED-R+)
$7N12118: C546.1 U158.22(XO) X14.1
$7N12120: C545.2 U158.21(XI) X14.3
$7N12125: C547.1 U158.23(AVDDK)
$7N12142: C549.2 R475.1 R476.1 R477.1 R478.1
$7N12151: C550.1 L35.4(TDCT)
$7N12152: C551.1 L35.3(RDCT)
$7N12157: L35.9(TXCT) R476.2
$7N12158: L35.10(RXCT) R475.2
$7N12160: C22.2 U158.9(DVDDK)
$8N3465: R230.1 U98.32(HDMI_HDP)
$8N3466: R229.1 U98.29(V5_IN)
$8N3506: R237.2 U98.21(UFP_CC1)
$8N3507: R238.2 U98.22(UFP_CC2)
$8N3508: R231.1 U98.63(TEST_EN)
$8N3556: R239.1 U98.55(GPIO5)
$8N3564: R240.2 U98.30(CFG_SDA)
$8N3565: R130.2 U98.31(CFG_SCL)
$8N21775: R59.2 U38.2(A) USB1.19(Hot Plug Detect)
$9N26205: LED12.2(A) R451.2
$9N26233: C530.2 U1.20(BIAS)
$9N26256: C528.2 Q2.2(S) U1.2(VBUS)
$10N1942: D24.2(A) L4.1 U108.1(LX)
$12N380: C437.1 U74.19(XI) X13.3
$12N381: C438.1 U74.20(XO) X13.1
Net-(C425-2): C425.2 R24.1 R195.1 U92.13(SBU1)
Net-(C426-2): C426.2 R23.1 R194.1 U92.14(SBU2)

Not connected (* = marked no-connect by the designer): CN2 5* 6*; U1 1(NC)* 5(NC)* 8(PWM)*; U92 20(LNC_N)* 21(LNC_P)* 23(LND_N)* 24(LND_P)*; U98 8(LANE2_P)* 9(LANE2_N)* 10(LANE3_P)* 11(LANE3_N)* 35(HDMI_CEC)* 50(GPIO10)* 53(GPIO7)* 54(GPIO6)* 56(GPIO20)* 57(GPIO21)*; U156 18(B1) 19(A1); U157 23(CFG)* 24(CC3)* 25(CC1)* 26(CC2)* 27(CC3_CTL)*; U158 12(NC.)* 14(GPIO6)* 16(NC.)* 19(NC.)* 20(SDIO)*; USB1 13(CEC)* 14(Utility)*; USB9 5(SSRX-) 6(SSRX+) 8(SSTX-) 9(SSTX+); USB16 5(SSRX-) 6(SSRX+) 8(SSTX-) 9(SSTX+)

## Notes on the sheets
sheet 4
- AMSEL
  0 2Lane DP
